# EasyEDA Pro project H7MS-before-compact-pcb-20261017.epro, schematic H7MS_CORE_H735_A1_核心板原理图, sheets 5 to 8 of 8

## Sheets
5 C04_BMI088与加热安全控制: Create Date: 2026-10-17; Update Date: 2026-10-17
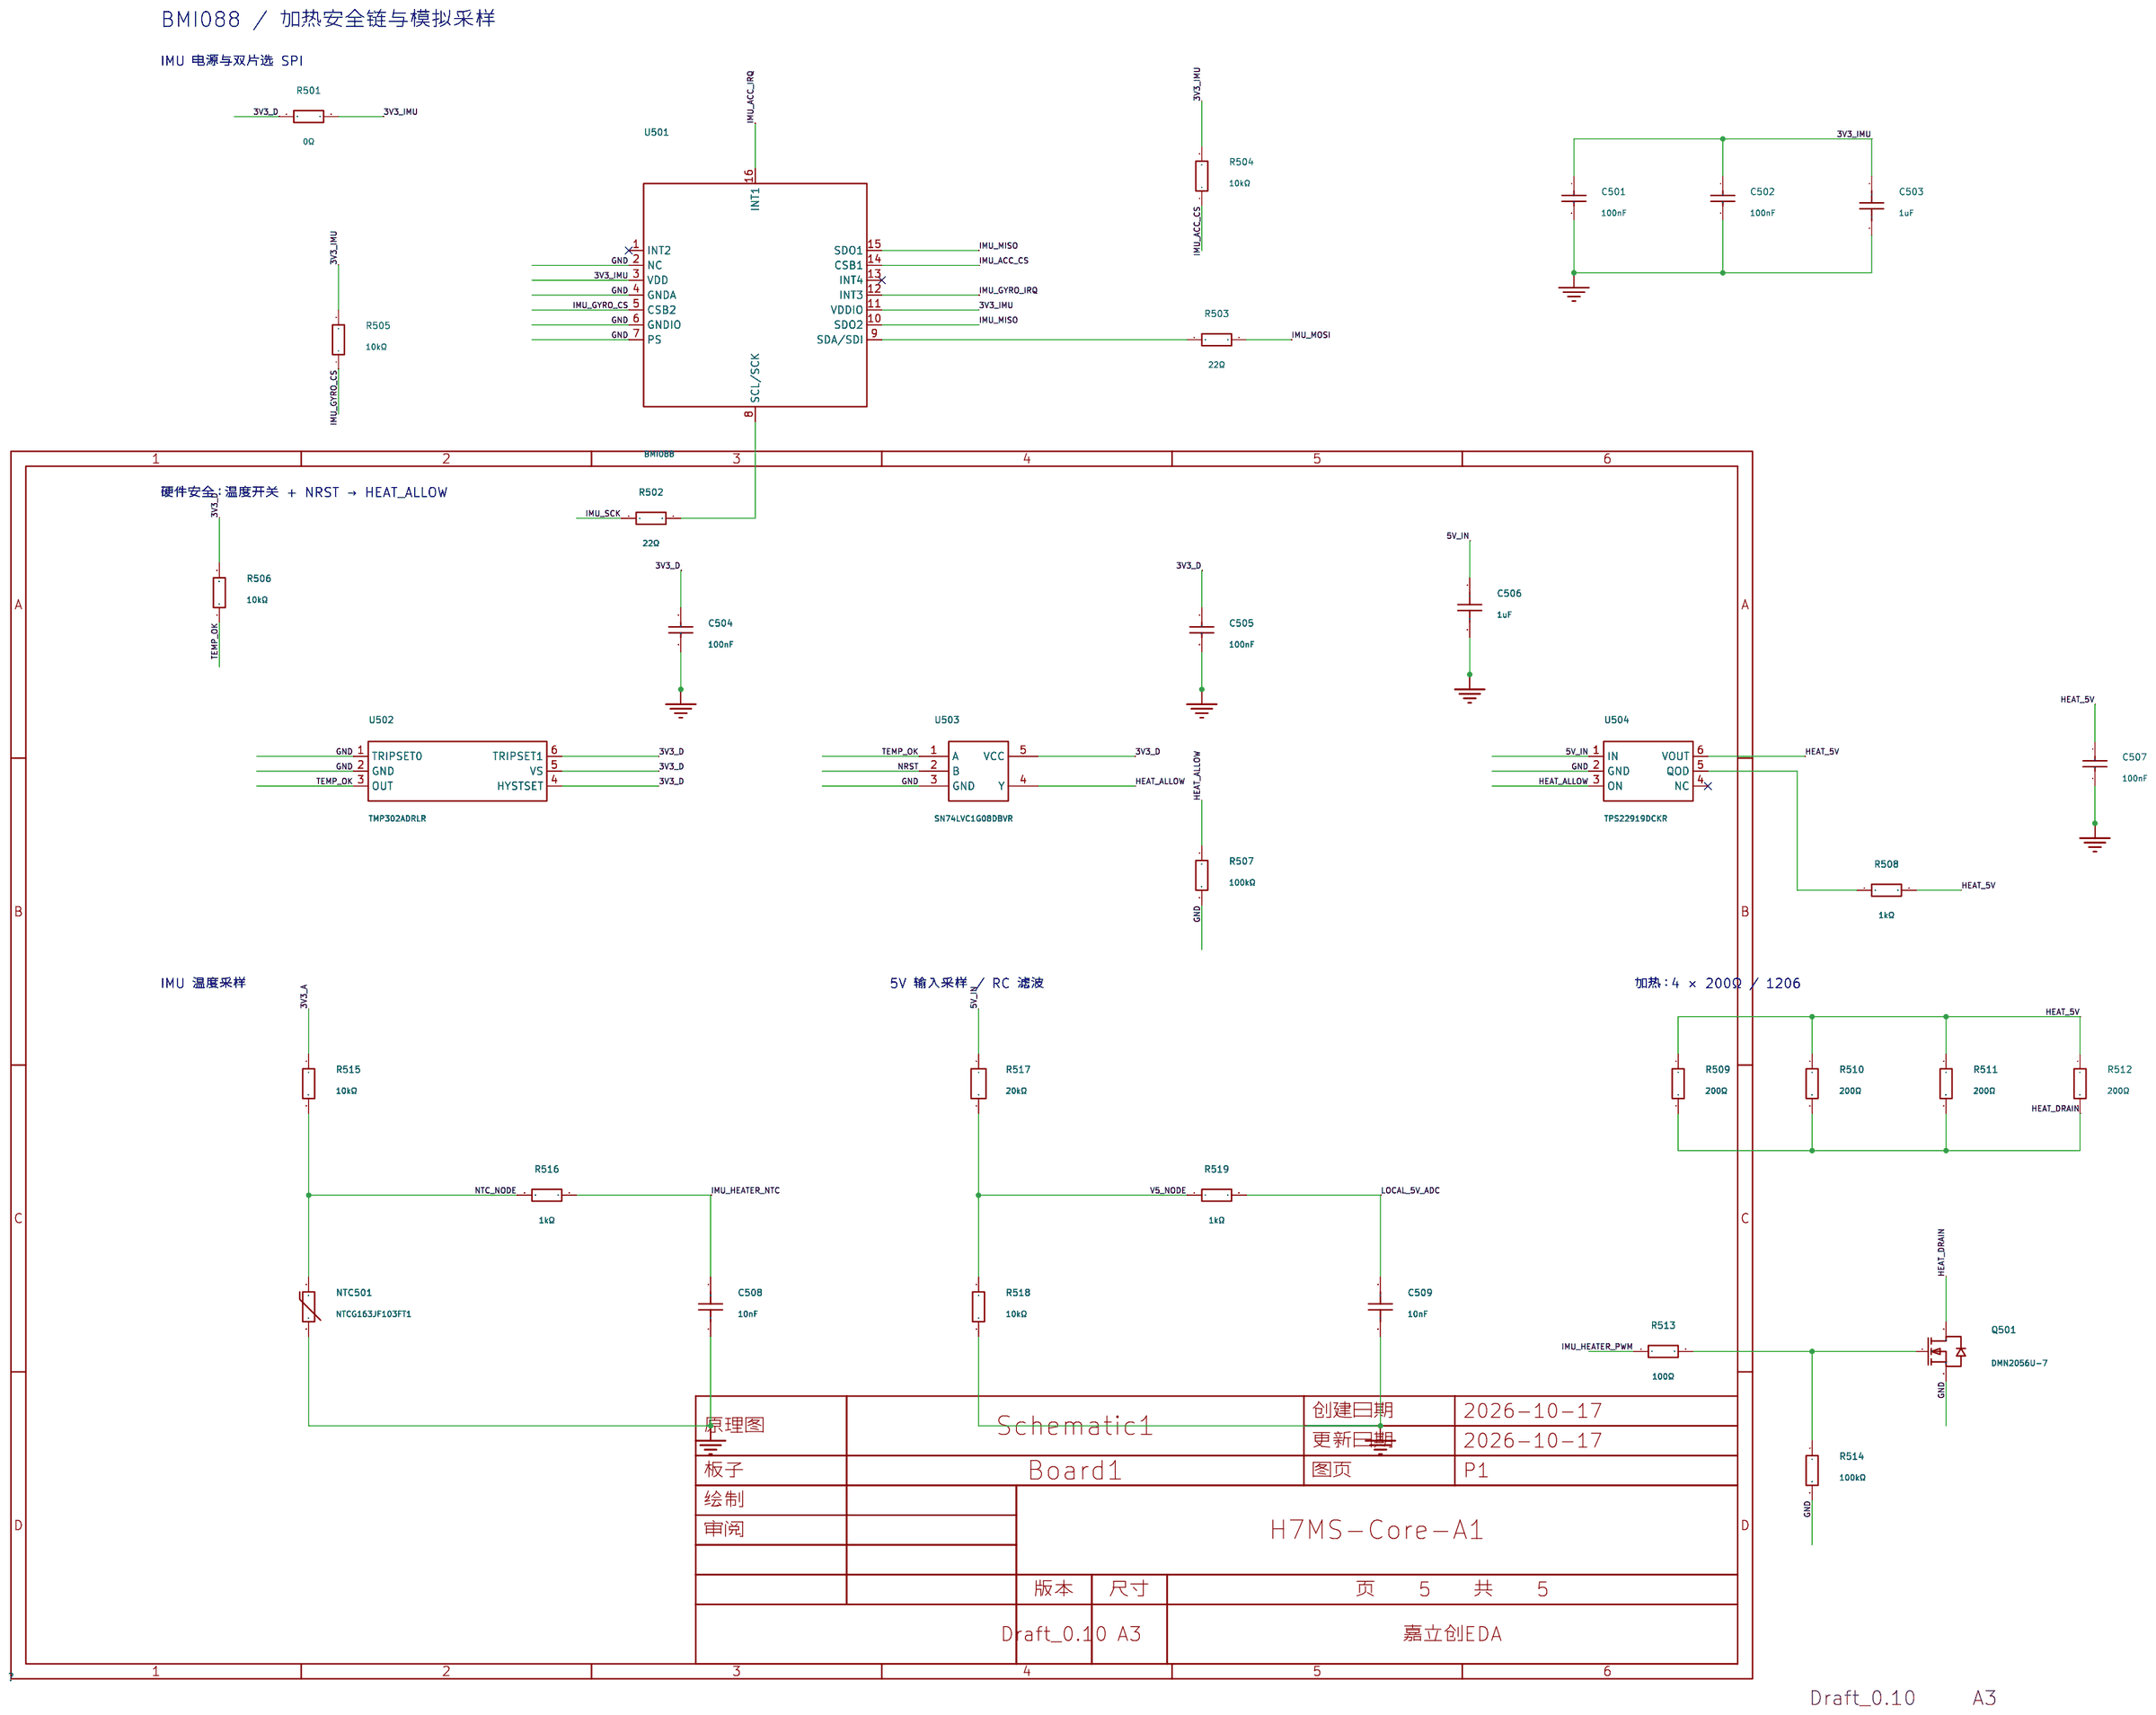
[diagram p4: C04_BMI088与加热安全控制]
6 C05_CAN三路收发与保护: Create Date: 2026-10-17; Update Date: 2026-10-17
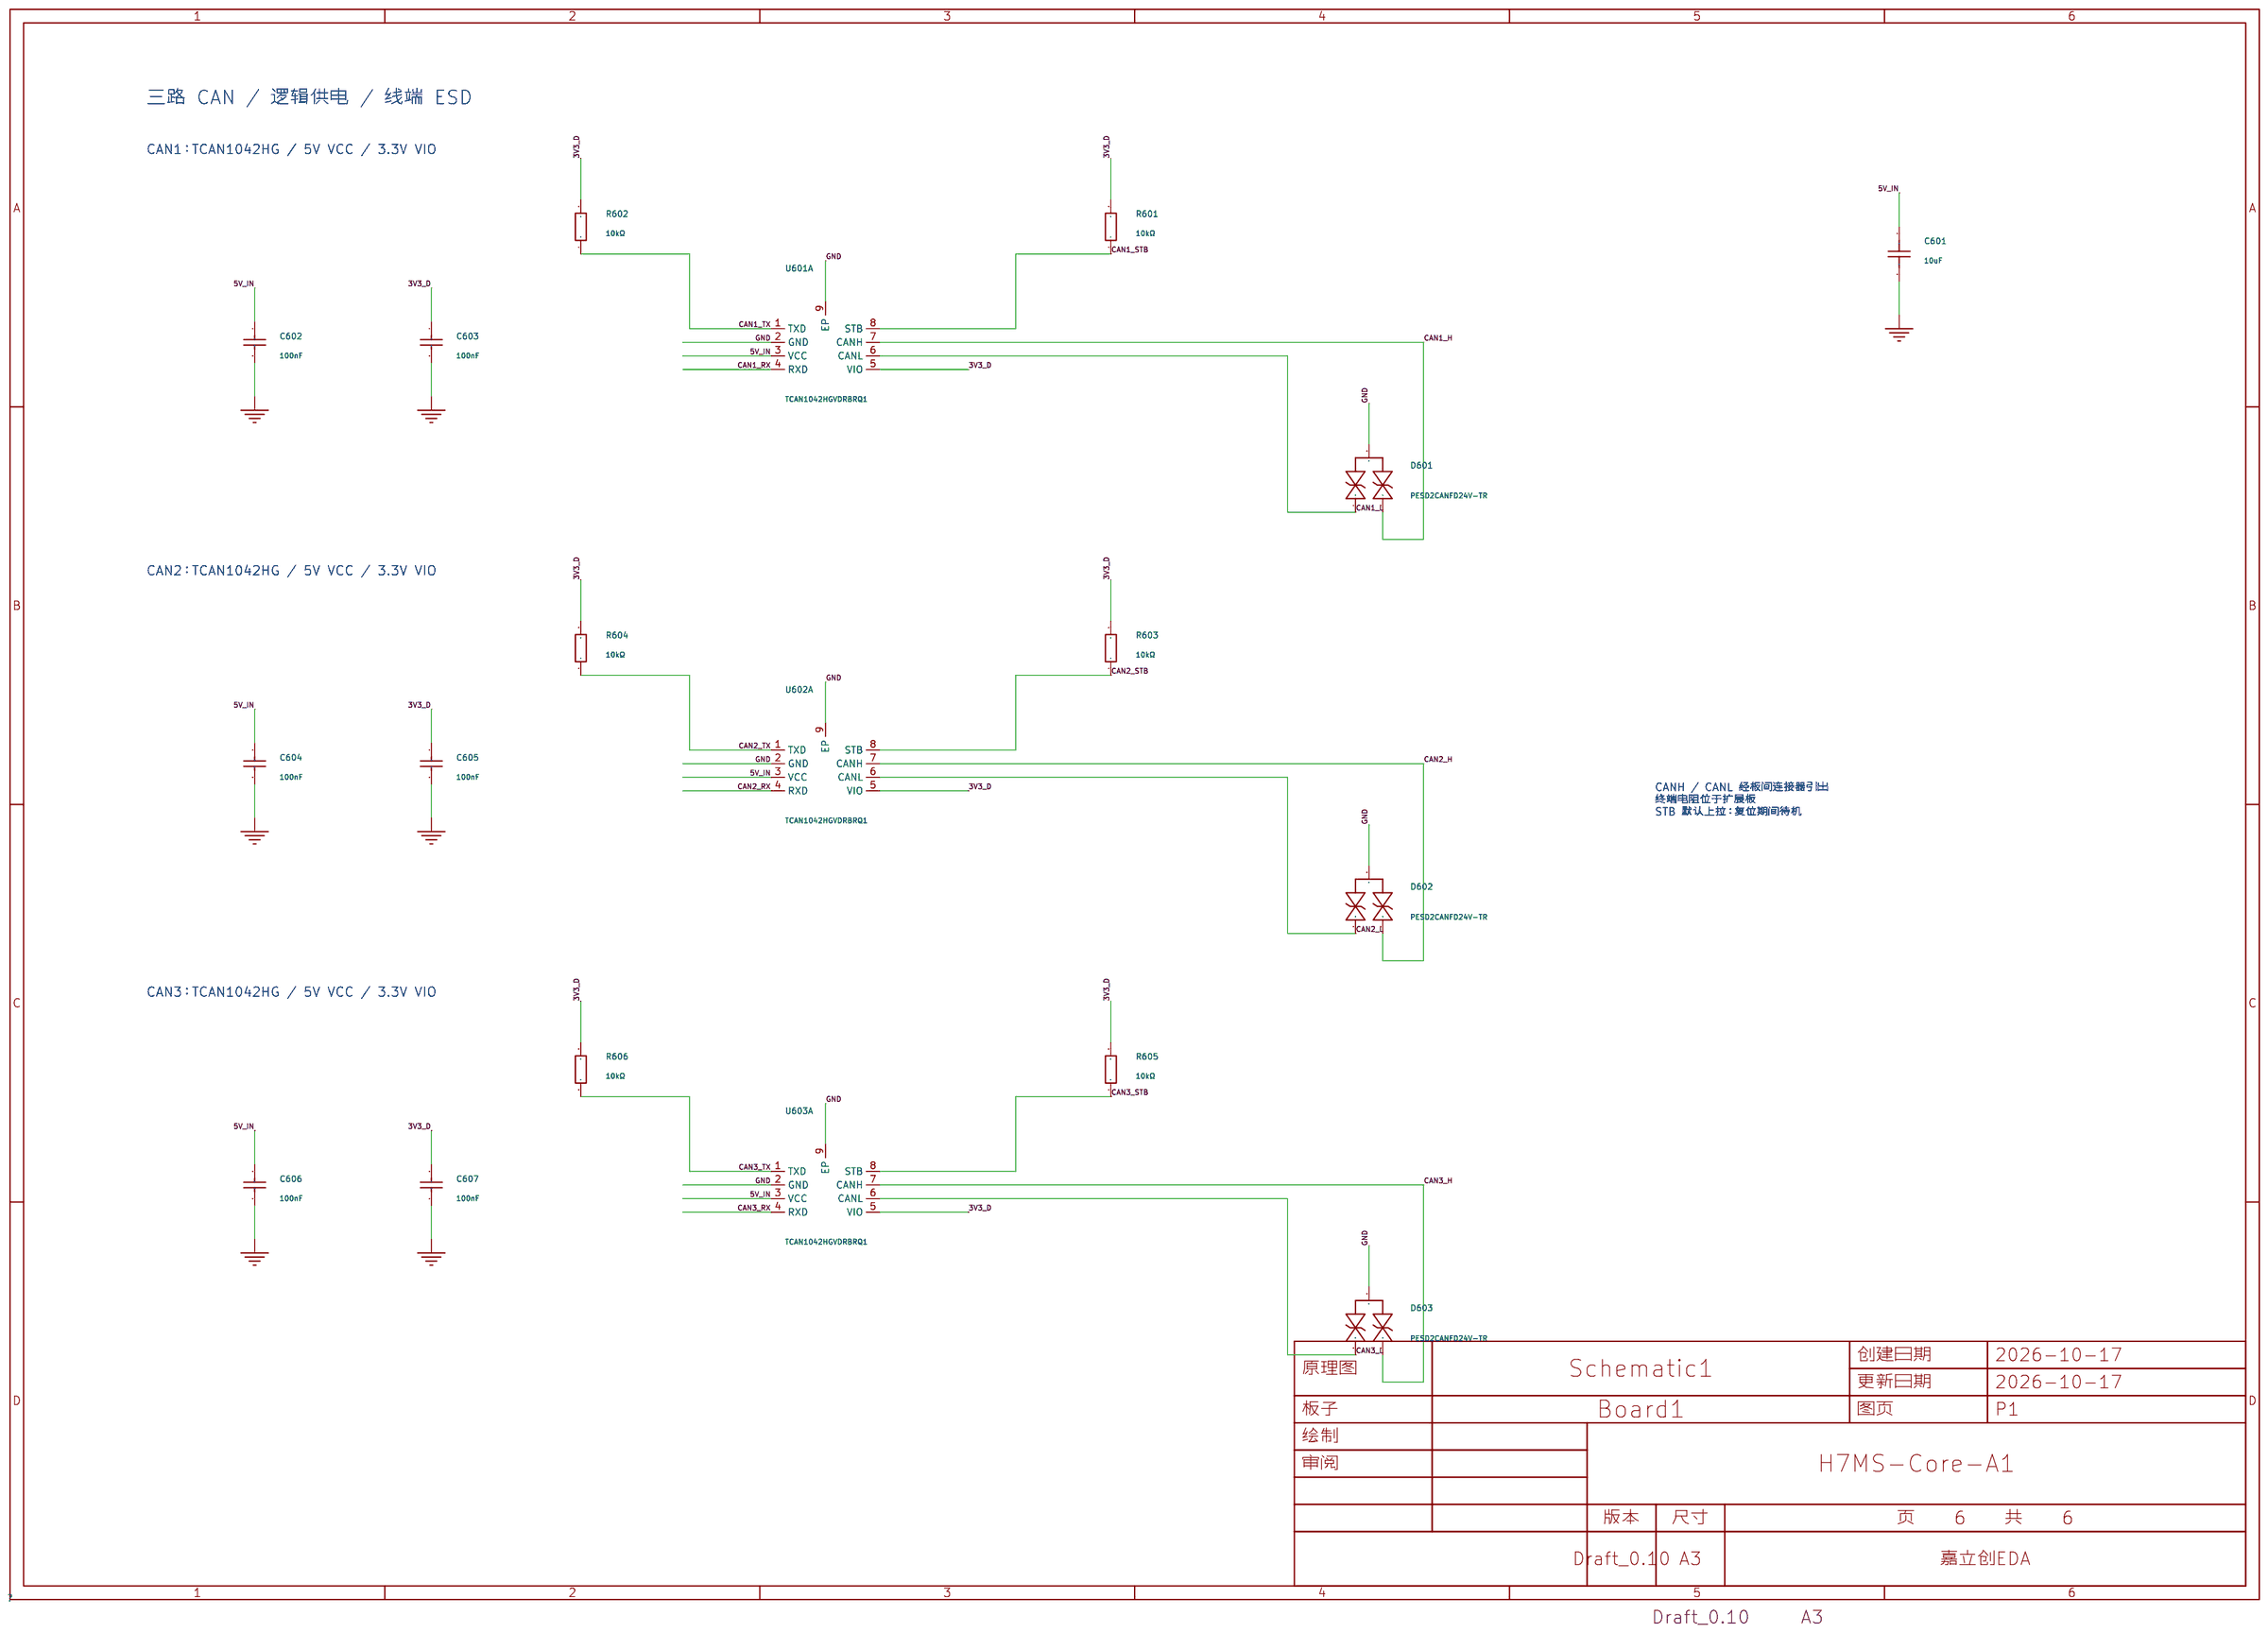
[diagram p5: C05_CAN三路收发与保护]
7 C06_USB设备接口与VBUS检测: Create Date: 2026-10-17; Update Date: 2026-10-17
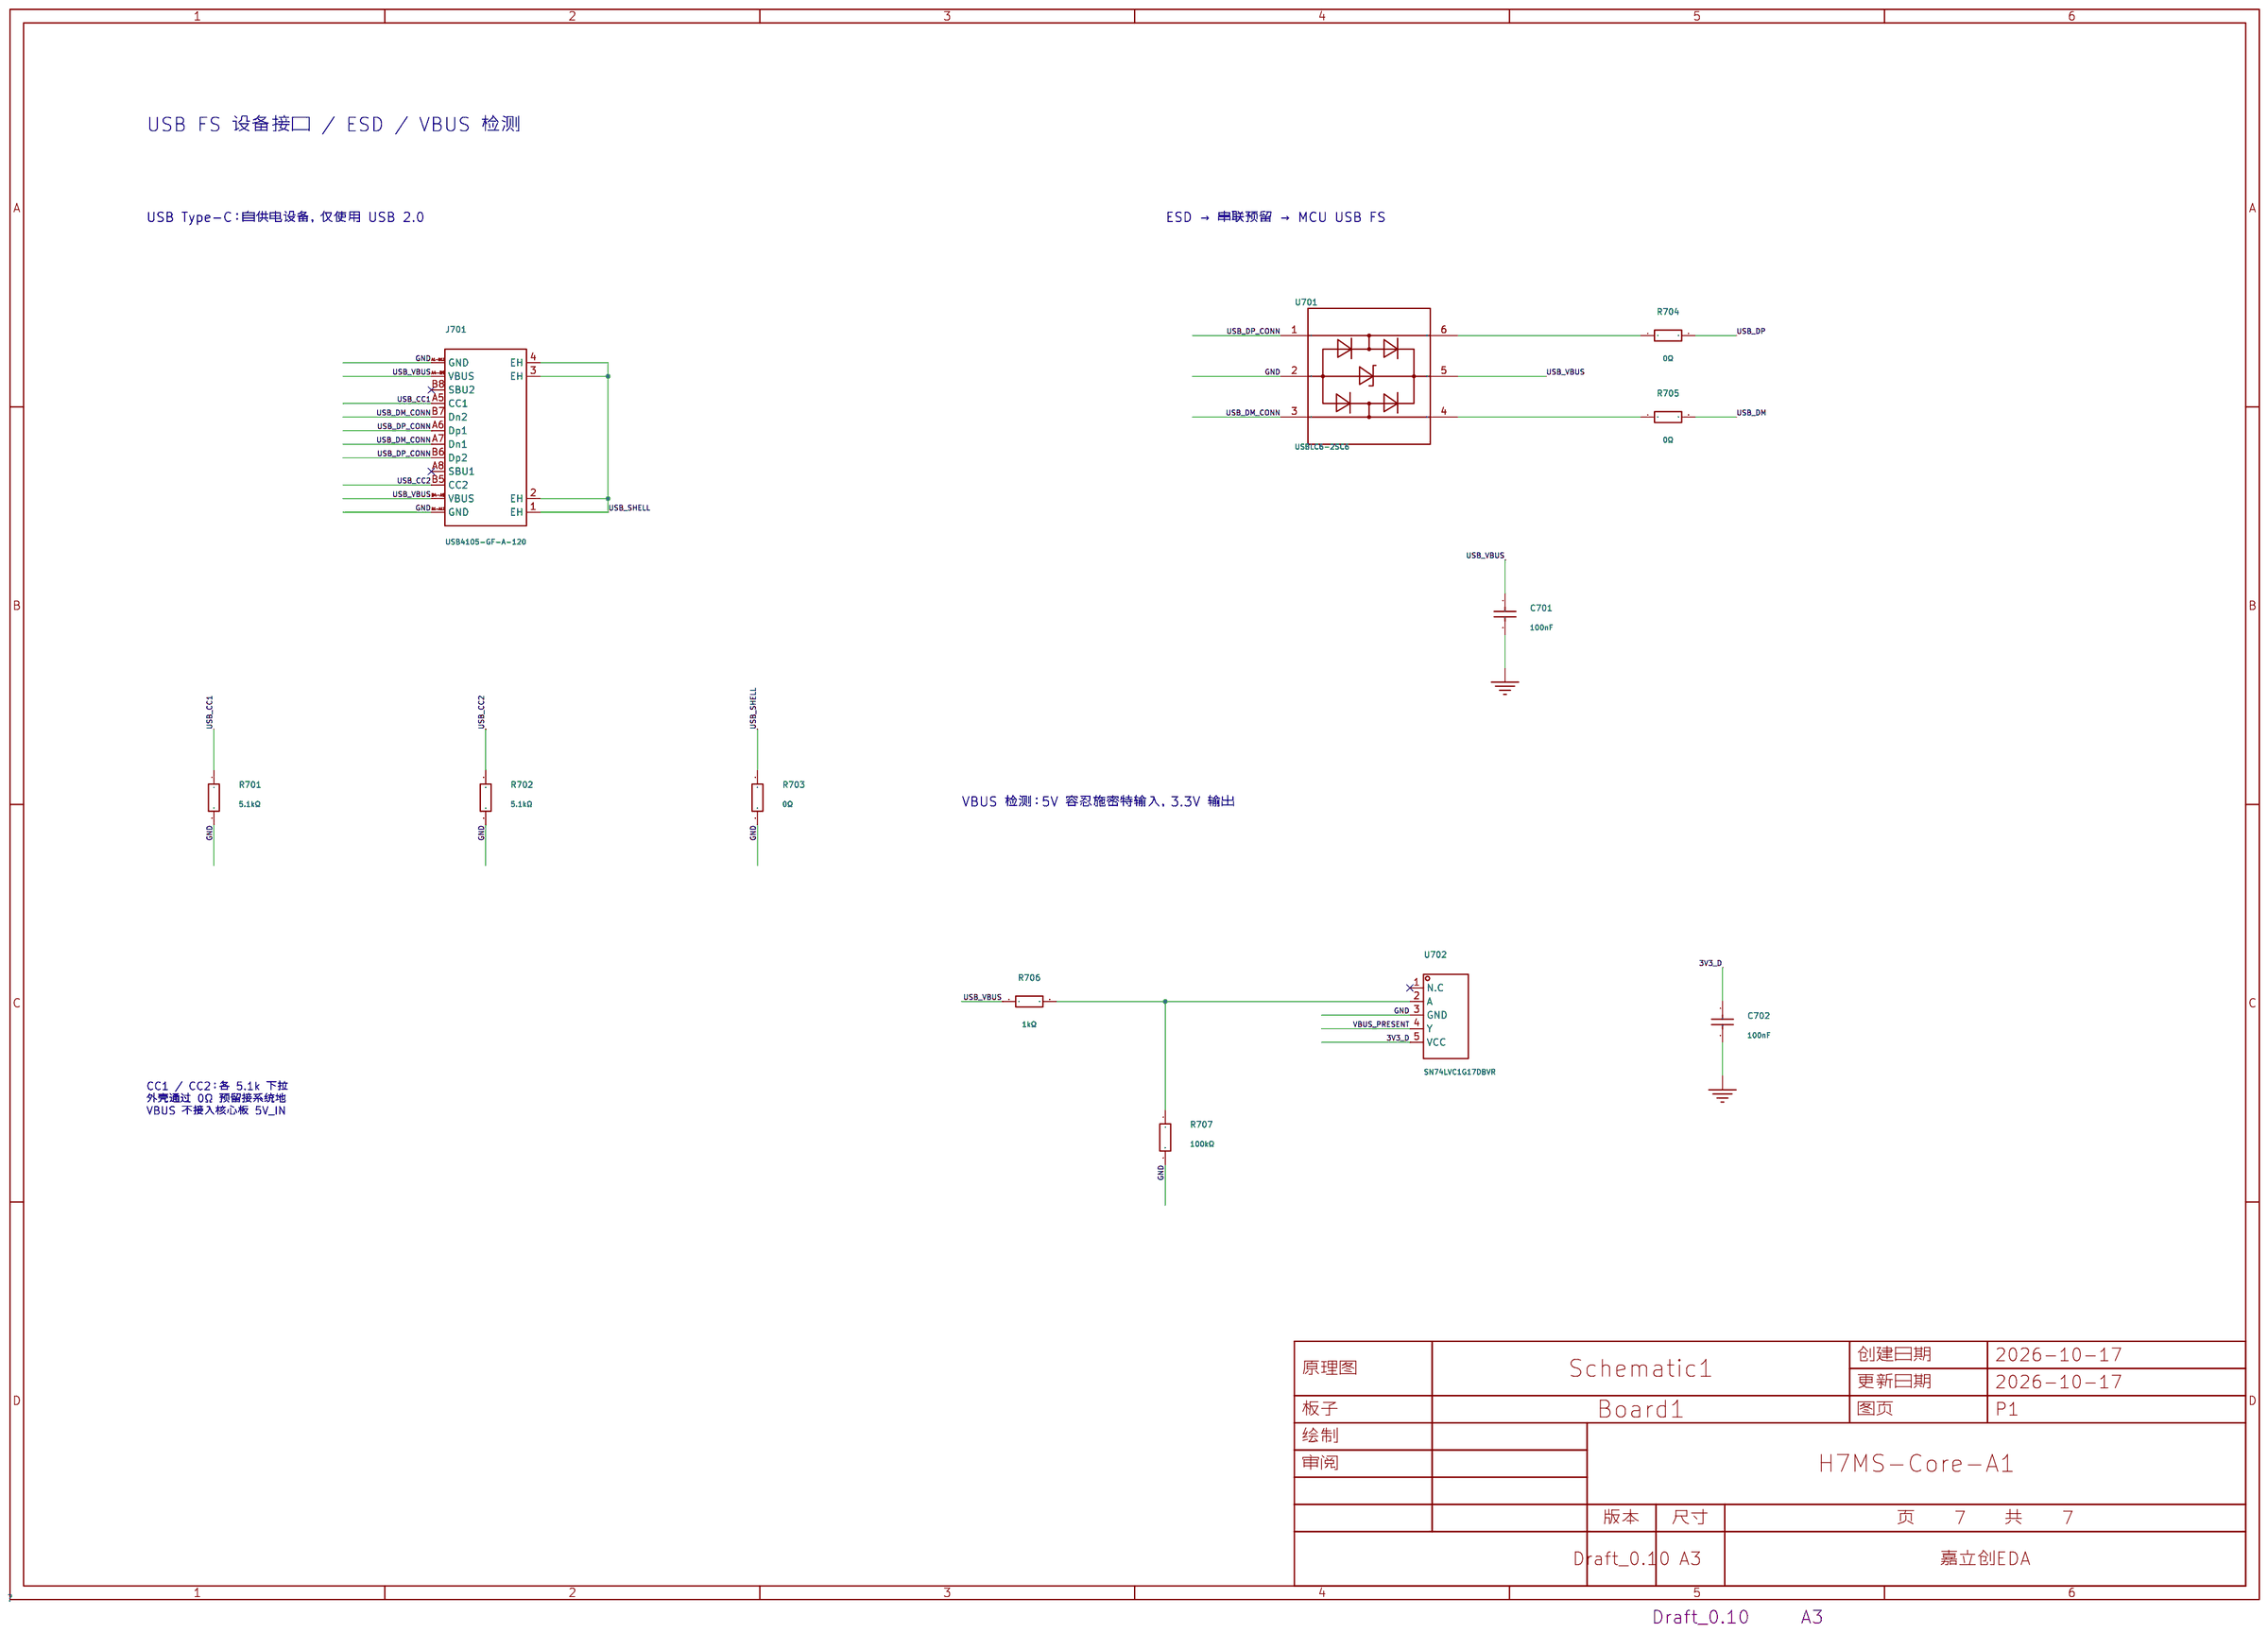
[diagram p6: C06_USB设备接口与VBUS检测]
8 C07_板间连接器与测试点: Create Date: 2026-10-17; Update Date: 2026-10-17
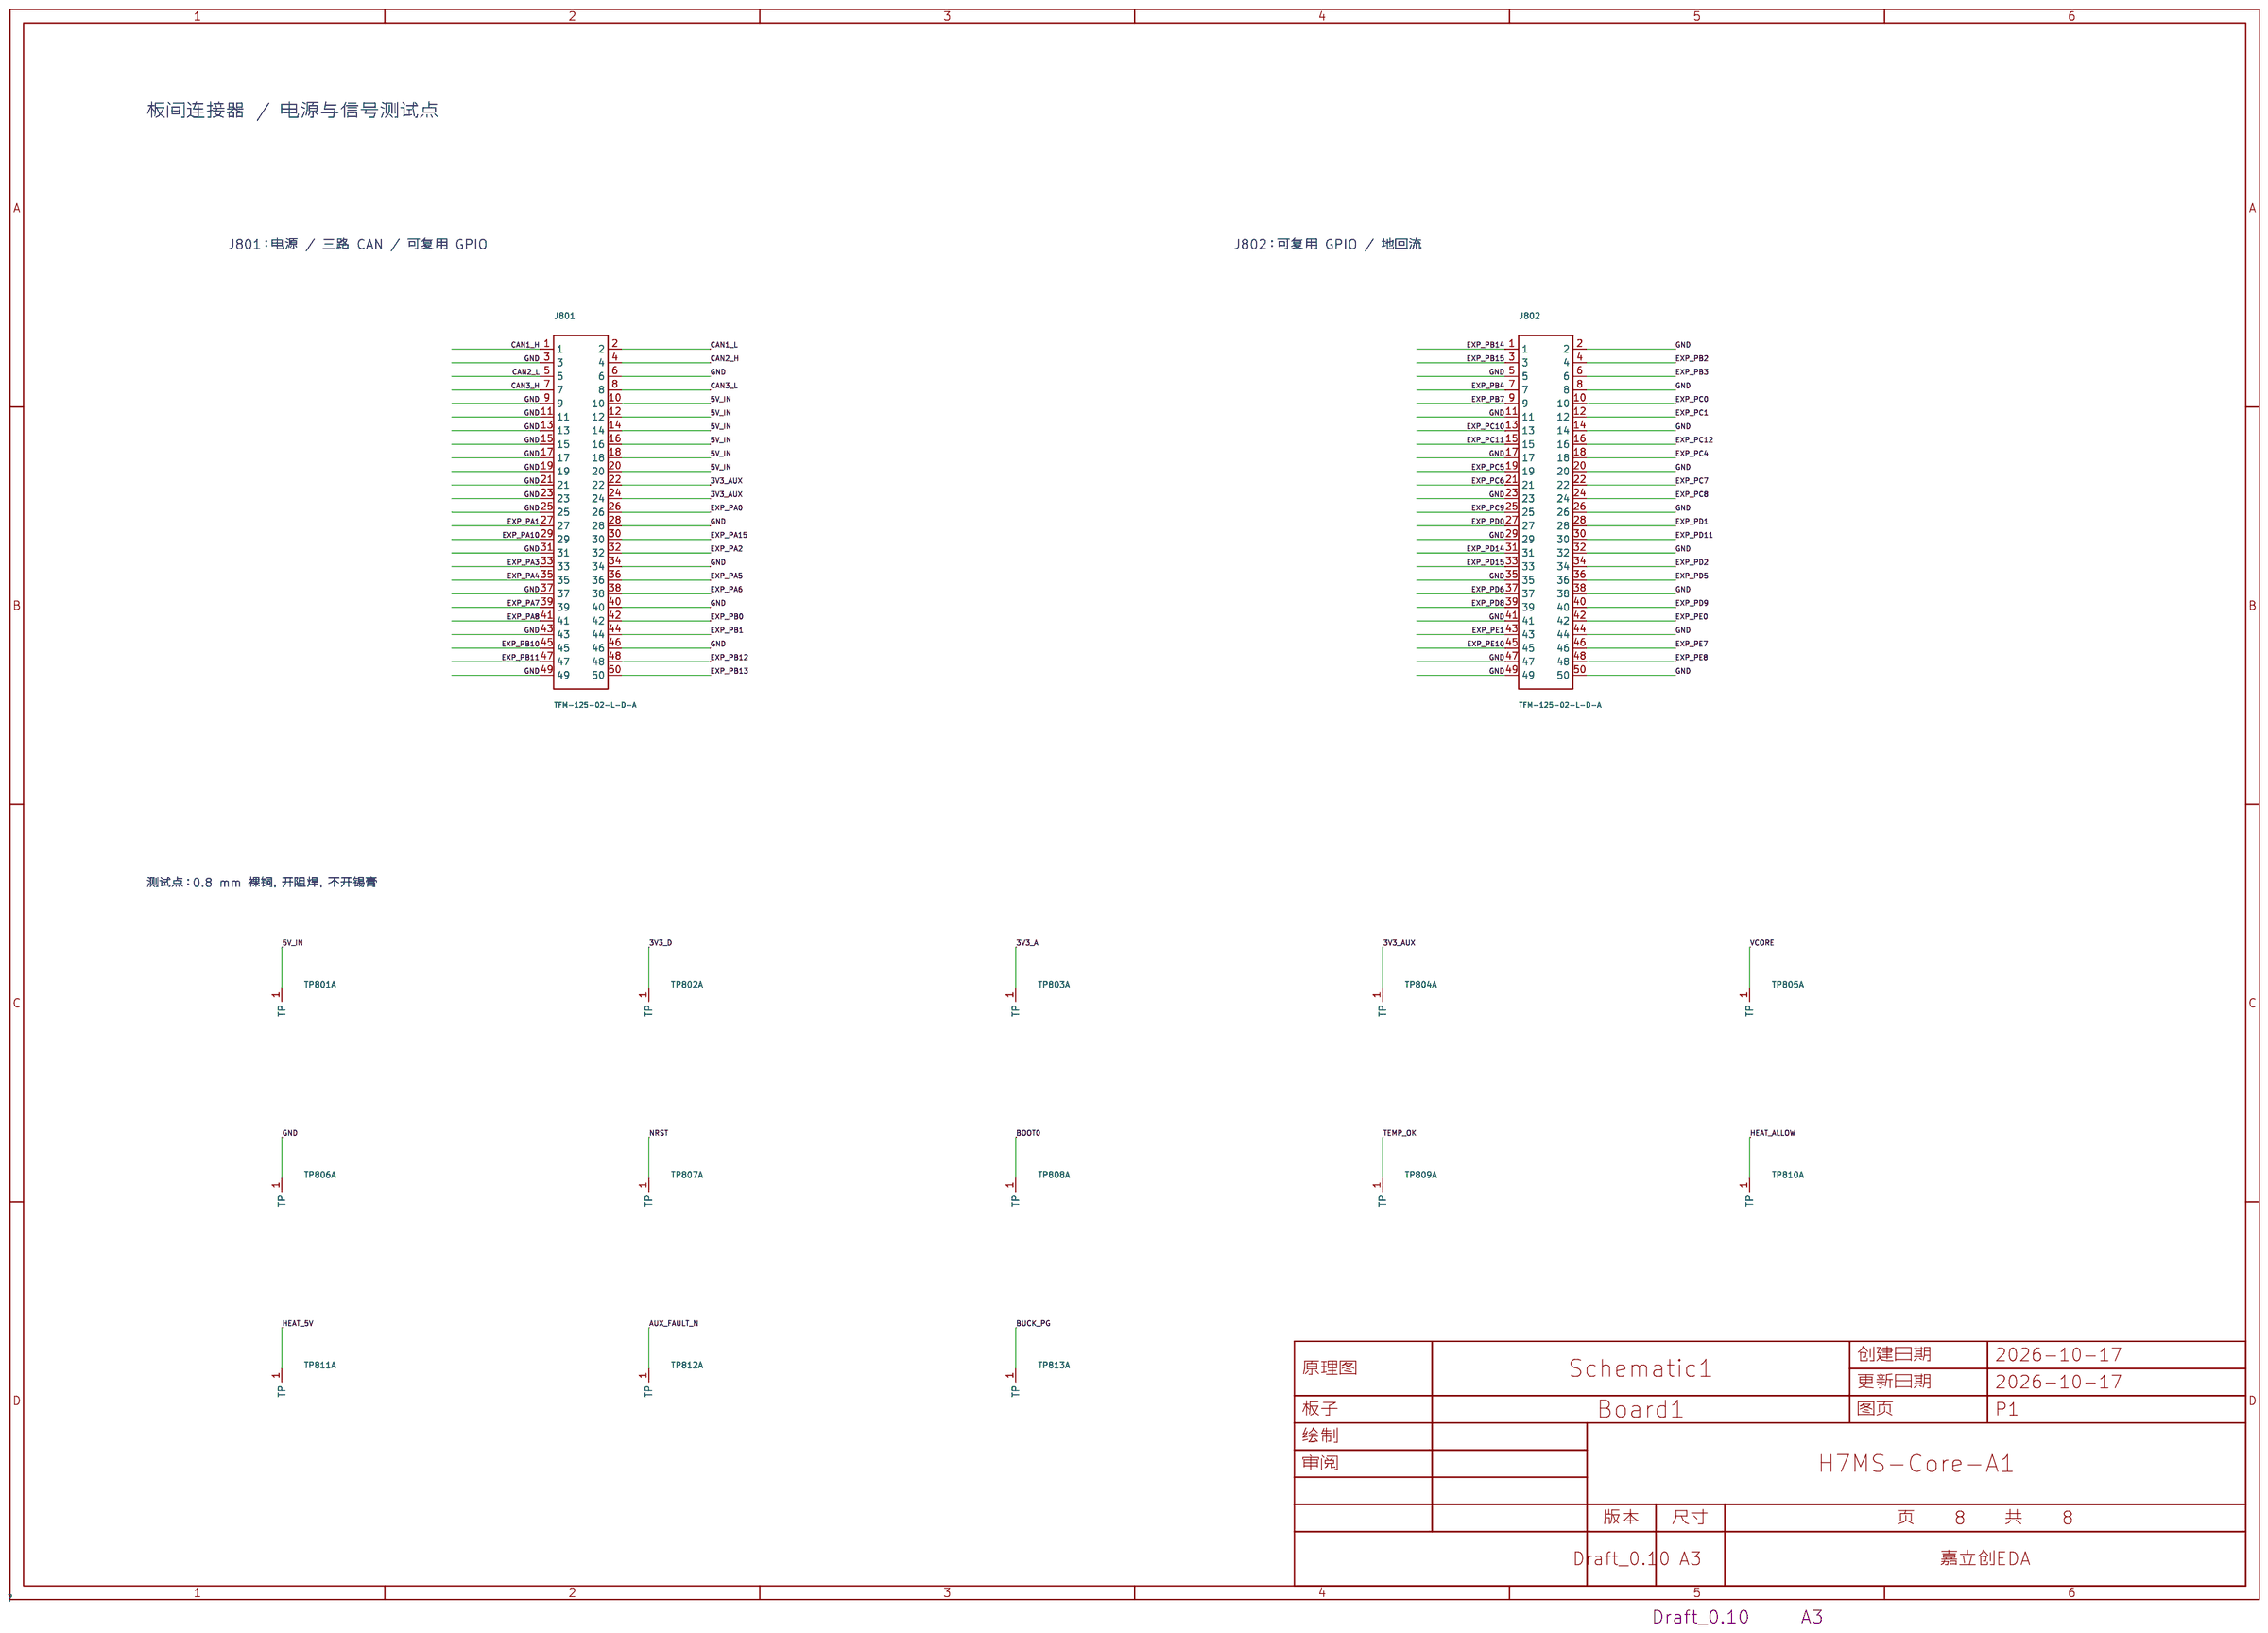
[diagram p7: C07_板间连接器与测试点]

## Parts
sheet C04_BMI088与加热安全控制
C501  100nF  [C0402]
C502  100nF  [C0402]
C503  1uF  [C0603]
C504  100nF  [C0402]
C505  100nF  [C0402]
C506  1uF  [C0603]
C507  100nF  [C0402]
C508  10nF  [C0402]
C509  10nF  [C0402]
NTC501  NTCG163JF103FT1  [R0603]
Q501  DMN2056U-7  [SOT-23-3_L2.9-W1.6-P1.90-LS2.8-BR]
R501  0Ω  [R0805]
R502  22Ω  [R0402]
R503  22Ω  [R0402]
R504  10kΩ  [R0402]
R505  10kΩ  [R0402]
R506  10kΩ  [R0402]
R507  100kΩ  [R0402]
R508  1kΩ  [R0402]
R509  200Ω  [R1206]
R510  200Ω  [R1206]
R511  200Ω  [R1206]
R512  200Ω  [R1206]
R513  100Ω  [R0402]
R514  100kΩ  [R0402]
R515  10kΩ  [R0402]
R516  1kΩ  [R0402]
R517  20kΩ  [R0402]
R518  10kΩ  [R0402]
R519  1kΩ  [R0402]
U501  BMI088  [LGA-16_L4.5-W3.0-P0.50-BL]
U502  TMP302ADRLR  [SOT-5X3-6_W1.6-L1.2-P0.50-LS1.6-BL]
U503  SN74LVC1G08DBVR  [SOT-23-5_L3.0-W1.7-P0.95-LS2.8-BR]
U504  TPS22919DCKR  [SC-70-6_L2.2-W1.3-P0.65-LS2.1-BR]
sheet C05_CAN三路收发与保护
C601  10uF  [C0805]
C602  100nF  [C0402]
C603  100nF  [C0402]
C604  100nF  [C0402]
C605  100nF  [C0402]
C606  100nF  [C0402]
C607  100nF  [C0402]
D601  PESD2CANFD24V-TR  [SOT-23-3_L2.9-W1.3-P1.90-LS2.4-BR]
D602  PESD2CANFD24V-TR  [SOT-23-3_L2.9-W1.3-P1.90-LS2.4-BR]
D603  PESD2CANFD24V-TR  [SOT-23-3_L2.9-W1.3-P1.90-LS2.4-BR]
R601  10kΩ  [R0402]
R602  10kΩ  [R0402]
R603  10kΩ  [R0402]
R604  10kΩ  [R0402]
R605  10kΩ  [R0402]
R606  10kΩ  [R0402]
U601  TCAN1042HGVDRBRQ1  [HVSON-8_L3.0-W3.0-P0.65-BL-EP]  (section 1)
U602  TCAN1042HGVDRBRQ1  [HVSON-8_L3.0-W3.0-P0.65-BL-EP]  (section 1)
U603  TCAN1042HGVDRBRQ1  [HVSON-8_L3.0-W3.0-P0.65-BL-EP]  (section 1)
sheet C06_USB设备接口与VBUS检测
C701  100nF  [C0402]
C702  100nF  [C0402]
J701  USB4105-GF-A-120  [H7MS_USB4105_GF_A_120_B4_R3]
R701  5.1kΩ  [R0402]
R702  5.1kΩ  [R0402]
R703  0Ω  [R0402]
R704  0Ω  [R0402]
R705  0Ω  [R0402]
R706  1kΩ  [R0402]
R707  100kΩ  [R0402]
U701  USBLC6-2SC6  [SOT-23-6_L2.9-W1.6-P0.95-LS2.8-BL]
U702  SN74LVC1G17DBVR  [SOT-23-5_L3.0-W1.7-P0.95-LS2.8-BR]
sheet C07_板间连接器与测试点
J801  TFM-125-02-L-D-A  [CONN-SMD_50P-P1.27_TFM-125-02-L-D-A]
J802  TFM-125-02-L-D-A  [CONN-SMD_50P-P1.27_TFM-125-02-L-D-A]
TP801  PCB_TP_0.8  [H7MS_TP_0p8_NOMASKPASTE]  (section 1)  (no BOM)
TP802  PCB_TP_0.8  [H7MS_TP_0p8_NOMASKPASTE]  (section 1)  (no BOM)
TP803  PCB_TP_0.8  [H7MS_TP_0p8_NOMASKPASTE]  (section 1)  (no BOM)
TP804  PCB_TP_0.8  [H7MS_TP_0p8_NOMASKPASTE]  (section 1)  (no BOM)
TP805  PCB_TP_0.8  [H7MS_TP_0p8_NOMASKPASTE]  (section 1)  (no BOM)
TP806  PCB_TP_0.8  [H7MS_TP_0p8_NOMASKPASTE]  (section 1)  (no BOM)
TP807  PCB_TP_0.8  [H7MS_TP_0p8_NOMASKPASTE]  (section 1)  (no BOM)
TP808  PCB_TP_0.8  [H7MS_TP_0p8_NOMASKPASTE]  (section 1)  (no BOM)
TP809  PCB_TP_0.8  [H7MS_TP_0p8_NOMASKPASTE]  (section 1)  (no BOM)
TP810  PCB_TP_0.8  [H7MS_TP_0p8_NOMASKPASTE]  (section 1)  (no BOM)
TP811  PCB_TP_0.8  [H7MS_TP_0p8_NOMASKPASTE]  (section 1)  (no BOM)
TP812  PCB_TP_0.8  [H7MS_TP_0p8_NOMASKPASTE]  (section 1)  (no BOM)
TP813  PCB_TP_0.8  [H7MS_TP_0p8_NOMASKPASTE]  (section 1)  (no BOM)

## Library data of the parts
C501 = C1005X7R1H104K050BB: 容值:100nF;精度:±10%;额定电压:50V;温度系数:X7R;; LCSC Part Name: 100nF ±10% 50V; Supplier Part: C2181015; Manufacturer: TDK; Supplier Footprint: 0402; JLCPCB Part Class: Extended Part; Datasheet: https://item.szlcsc.com/datasheet/C1005X7R1H104K050BB/2273082.html; Supplier: LCSC; Tolerance: ±10%; Voltage Rating: 50V; Temperature Coefficient: X7R; Function: C_IMU_VDD; H7MS_Function: C_IMU_VDD
C502 = C1005X7R1H104K050BB: 容值:100nF;精度:±10%;额定电压:50V;温度系数:X7R;; LCSC Part Name: 100nF ±10% 50V; Supplier Part: C2181015; Manufacturer: TDK; Supplier Footprint: 0402; JLCPCB Part Class: Extended Part; Datasheet: https://item.szlcsc.com/datasheet/C1005X7R1H104K050BB/2273082.html; Supplier: LCSC; Tolerance: ±10%; Voltage Rating: 50V; Temperature Coefficient: X7R; Function: C_IMU_VDDIO; H7MS_Function: C_IMU_VDDIO
C503 = C1608X7R1C105K080AC: 容值:1uF;精度:±10%;额定电压:16V;温度系数:X7R;; LCSC Part Name: 1uF ±10% 16V; Supplier Part: C2167399; Manufacturer: TDK; Supplier Footprint: 0603; JLCPCB Part Class: Extended Part; Datasheet: https://item.szlcsc.com/datasheet/C1608X7R1C105K080AC/2259451.html; Supplier: LCSC; Tolerance: ±10%; Voltage Rating: 16V; Temperature Coefficient: X7R; Function: C_IMU_BULK; H7MS_Function: C_IMU_BULK
C504 = C1005X7R1H104K050BB: 容值:100nF;精度:±10%;额定电压:50V;温度系数:X7R;; LCSC Part Name: 100nF ±10% 50V; Supplier Part: C2181015; Manufacturer: TDK; Supplier Footprint: 0402; JLCPCB Part Class: Extended Part; Datasheet: https://item.szlcsc.com/datasheet/C1005X7R1H104K050BB/2273082.html; Supplier: LCSC; Tolerance: ±10%; Voltage Rating: 50V; Temperature Coefficient: X7R; Function: C_TEMP; H7MS_Function: C_TEMP
C505 = C1005X7R1H104K050BB: 容值:100nF;精度:±10%;额定电压:50V;温度系数:X7R;; LCSC Part Name: 100nF ±10% 50V; Supplier Part: C2181015; Manufacturer: TDK; Supplier Footprint: 0402; JLCPCB Part Class: Extended Part; Datasheet: https://item.szlcsc.com/datasheet/C1005X7R1H104K050BB/2273082.html; Supplier: LCSC; Tolerance: ±10%; Voltage Rating: 50V; Temperature Coefficient: X7R; Function: C_U_HEAT_GATE; H7MS_Function: C_U_HEAT_GATE
C506 = C1608X7R1C105K080AC: 容值:1uF;精度:±10%;额定电压:16V;温度系数:X7R;; LCSC Part Name: 1uF ±10% 16V; Supplier Part: C2167399; Manufacturer: TDK; Supplier Footprint: 0603; JLCPCB Part Class: Extended Part; Datasheet: https://item.szlcsc.com/datasheet/C1608X7R1C105K080AC/2259451.html; Supplier: LCSC; Tolerance: ±10%; Voltage Rating: 16V; Temperature Coefficient: X7R; Function: C_U_HEAT_POWER_IN; H7MS_Function: C_U_HEAT_POWER_IN
C507 = C1005X7R1H104K050BB: 容值:100nF;精度:±10%;额定电压:50V;温度系数:X7R;; LCSC Part Name: 100nF ±10% 50V; Supplier Part: C2181015; Manufacturer: TDK; Supplier Footprint: 0402; JLCPCB Part Class: Extended Part; Datasheet: https://item.szlcsc.com/datasheet/C1005X7R1H104K050BB/2273082.html; Supplier: LCSC; Tolerance: ±10%; Voltage Rating: 50V; Temperature Coefficient: X7R; Function: C_U_HEAT_POWER_OUT; H7MS_Function: C_U_HEAT_POWER_OUT
C508 = GRM1555C1H103JE01D: 容值:10nF;精度:±5%;额定电压:50V;温度系数:C0G;; LCSC Part Name: 10nF ±5% 50V; Supplier Part: C22400107; Manufacturer: muRata(村田); Supplier Footprint: 0402; JLCPCB Part Class: Extended Part; Datasheet: https://atta.szlcsc.com/upload/public/pdf/source/20240516/4A564BD6D055E5006B75B6B7BBF3AC7F.pdf; Supplier: LCSC; Tolerance: ±5%; Voltage Rating: 50V; Temperature Coefficient: C0G; Function: C_NTC; H7MS_Function: C_NTC
C509 = GRM1555C1H103JE01D: 容值:10nF;精度:±5%;额定电压:50V;温度系数:C0G;; LCSC Part Name: 10nF ±5% 50V; Supplier Part: C22400107; Manufacturer: muRata(村田); Supplier Footprint: 0402; JLCPCB Part Class: Extended Part; Datasheet: https://atta.szlcsc.com/upload/public/pdf/source/20240516/4A564BD6D055E5006B75B6B7BBF3AC7F.pdf; Supplier: LCSC; Tolerance: ±5%; Voltage Rating: 50V; Temperature Coefficient: C0G; Function: C_V5; H7MS_Function: C_V5
NTC501 = NTCG163JF103FT1: 功率:100mW;阻值:10kΩ;电阻精度:±1%;B值精度:±1%;B值(25℃/50℃):3380K;最大稳态电流(25℃):310uA;; LCSC Part Name: 10kΩ 3380K 100mW; Supplier Part: C76589; Manufacturer: TDK; Supplier Footprint: 0603; JLCPCB Part Class: Extended Part; Datasheet: https://item.szlcsc.com/datasheet/NTCG163JF103FT1/77716.html; Supplier: LCSC; Power(Watts): 100mW; Resistance @ 25℃: 10kΩ; Resistance Tolerance: ±1%; B Constant Tolerance: ±1%; B Constant (25℃/50℃): 3380K; B Constant (25℃/75℃): 3422K; B Constant (25℃/85℃): 3435K; B Constant (25℃/100℃): 3453K; Steady State Current (Max): 310uA; Dissipation Factor: 1mW/℃; Operating Temperature: -40℃~+125℃; Length: 1.6mm; Width: 0.8mm; Height: 0.8mm; Function: NTC1; H7MS_Function: NTC1
Q501 = DMN2056U-7: 数量:1个N沟道;漏源电压(Vdss):20V;连续漏极电流(Id):4A;导通电阻(RDS(on)):45mΩ@2.5V;耗散功率(Pd):940mW;阈值电压(Vgs(th)):1V;; LCSC Part Name: 1个N沟道 耐压:20V 电流:4A; Supplier Part: C332302; Manufacturer: DIODES(美台); Supplier Footprint: SOT-23; JLCPCB Part Class: Extended Part; Datasheet: https://item.szlcsc.com/datasheet/DMN2056U-7/311108.html; Supplier: LCSC; Number: 1个N沟道; Drain to Source Voltage: 20V; Current - Continuous Drain(Id): 4A; RDS(on): 45mΩ@2.5V; Pd - Power Dissipation: 940mW; Gate Threshold Voltage (Vgs(th)): 1V; Gate Charge(Qg): 4.3nC@4.5V; Input Capacitance(Ciss): 339pF; Reverse Transfer Capacitance (Crss@Vds): 34pF; Operating Temperature: -55℃~+150℃; Type: N沟道; Output Capacitance(Coss): 47pF; Function: Q_HEAT; H7MS_Function: Q_HEAT
R501 = RC0805JR-070RL: 电阻类型:厚膜电阻;阻值:0Ω;精度:±5%;功率:125mW;工作电压:150V;温度系数:-;; LCSC Part Name: 厚膜电阻 0Ω ±5% 125mW; Supplier Part: C96345; Manufacturer: YAGEO(国巨); Supplier Footprint: 0805; JLCPCB Part Class: Extended Part; Datasheet: https://item.szlcsc.com/datasheet/RC0805JR-070RL/97549.html; Supplier: LCSC; Type: 厚膜电阻; Tolerance: ±5%; Power(Watts): 125mW; Voltage-Supply(Max): 150V; Operating Temperature: -55℃~+155℃; Function: R_IMU_POWER; H7MS_Function: R_IMU_POWER
R502 = RC0402FR-0722RL: 电阻类型:厚膜电阻;阻值:22Ω;精度:±1%;功率:62.5mW;最大工作电压:50V;温度系数:±100ppm/℃;; LCSC Part Name: 厚膜电阻 22Ω ±1% 62.5mW; Supplier Part: C114765; Manufacturer: YAGEO(国巨); Supplier Footprint: 0402; JLCPCB Part Class: Extended Part; Datasheet: https://atta.szlcsc.com/upload/public/pdf/source/20180821/C275644_0D56F95EFF785E7D9A1FEF436B37DA78.pdf; Supplier: LCSC; Type: 厚膜电阻; Tolerance: ±1%; Power(Watts): 62.5mW; Overload Voltage (Max): 50V; Temperature Coefficient: ±100ppm/℃; Operating Temperature Range: -55℃~+155℃; Function: R_IMU_SCK; H7MS_Function: R_IMU_SCK
R503 = RC0402FR-0722RL: 电阻类型:厚膜电阻;阻值:22Ω;精度:±1%;功率:62.5mW;最大工作电压:50V;温度系数:±100ppm/℃;; LCSC Part Name: 厚膜电阻 22Ω ±1% 62.5mW; Supplier Part: C114765; Manufacturer: YAGEO(国巨); Supplier Footprint: 0402; JLCPCB Part Class: Extended Part; Datasheet: https://atta.szlcsc.com/upload/public/pdf/source/20180821/C275644_0D56F95EFF785E7D9A1FEF436B37DA78.pdf; Supplier: LCSC; Type: 厚膜电阻; Tolerance: ±1%; Power(Watts): 62.5mW; Overload Voltage (Max): 50V; Temperature Coefficient: ±100ppm/℃; Operating Temperature Range: -55℃~+155℃; Function: R_IMU_MOSI; H7MS_Function: R_IMU_MOSI
R504 = RC0402FR-0710KL: 电阻类型:厚膜电阻;阻值:10kΩ;精度:±1%;功率:62.5mW;工作电压:50V;温度系数:±100ppm/℃;; LCSC Part Name: 厚膜电阻 10kΩ ±1% 62.5mW; Supplier Part: C60490; Manufacturer: YAGEO(国巨); Supplier Footprint: 0402; JLCPCB Part Class: Extended Part; Datasheet: https://item.szlcsc.com/datasheet/RC0402FR-0710KL/61542.html; Supplier: LCSC; Type: 厚膜电阻; Tolerance: ±1%; Power(Watts): 62.5mW; Voltage-Supply(Max): 50V; Temperature Coefficient: ±100ppm/℃; Operating Temperature: -55℃~+155℃; Function: R_IMU_ACC_CS; H7MS_Function: R_IMU_ACC_CS
R505 = RC0402FR-0710KL: 电阻类型:厚膜电阻;阻值:10kΩ;精度:±1%;功率:62.5mW;工作电压:50V;温度系数:±100ppm/℃;; LCSC Part Name: 厚膜电阻 10kΩ ±1% 62.5mW; Supplier Part: C60490; Manufacturer: YAGEO(国巨); Supplier Footprint: 0402; JLCPCB Part Class: Extended Part; Datasheet: https://item.szlcsc.com/datasheet/RC0402FR-0710KL/61542.html; Supplier: LCSC; Type: 厚膜电阻; Tolerance: ±1%; Power(Watts): 62.5mW; Voltage-Supply(Max): 50V; Temperature Coefficient: ±100ppm/℃; Operating Temperature: -55℃~+155℃; Function: R_IMU_GYRO_CS; H7MS_Function: R_IMU_GYRO_CS
R506 = RC0402FR-0710KL: 电阻类型:厚膜电阻;阻值:10kΩ;精度:±1%;功率:62.5mW;工作电压:50V;温度系数:±100ppm/℃;; LCSC Part Name: 厚膜电阻 10kΩ ±1% 62.5mW; Supplier Part: C60490; Manufacturer: YAGEO(国巨); Supplier Footprint: 0402; JLCPCB Part Class: Extended Part; Datasheet: https://item.szlcsc.com/datasheet/RC0402FR-0710KL/61542.html; Supplier: LCSC; Type: 厚膜电阻; Tolerance: ±1%; Power(Watts): 62.5mW; Voltage-Supply(Max): 50V; Temperature Coefficient: ±100ppm/℃; Operating Temperature: -55℃~+155℃; Function: R_TEMP; H7MS_Function: R_TEMP
R507 = RC0402FR-07100KL: 电阻类型:厚膜电阻;阻值:100kΩ;精度:±1%;功率:62.5mW;工作电压:50V;温度系数:±100ppm/℃;; LCSC Part Name: 厚膜电阻 100kΩ ±1% 62.5mW; Supplier Part: C60491; Manufacturer: YAGEO(国巨); Supplier Footprint: 0402; JLCPCB Part Class: Extended Part; Datasheet: https://item.szlcsc.com/datasheet/RC0402FR-07100KL/61543.html; Supplier: LCSC; Type: 厚膜电阻; Tolerance: ±1%; Power(Watts): 62.5mW; Voltage-Supply(Max): 50V; Temperature Coefficient: ±100ppm/℃; Operating Temperature: -55℃~+155℃; Function: R_HEAT_ALLOW; H7MS_Function: R_HEAT_ALLOW
R508 = RC0402FR-071KL: 电阻类型:厚膜电阻;阻值:1kΩ;精度:±1%;功率:62.5mW;工作电压:50V;温度系数:±100ppm/℃;; LCSC Part Name: 厚膜电阻 1kΩ ±1% 62.5mW; Supplier Part: C106235; Manufacturer: YAGEO(国巨); Supplier Footprint: 0402; JLCPCB Part Class: Extended Part; Datasheet: https://item.szlcsc.com/datasheet/RC0402FR-071KL/107450.html; Supplier: LCSC; Type: 厚膜电阻; Tolerance: ±1%; Power(Watts): 62.5mW; Voltage-Supply(Max): 50V; Temperature Coefficient: ±100ppm/℃; Operating Temperature: -55℃~+155℃; Function: R_U_HEAT_POWER_QOD; H7MS_Function: R_U_HEAT_POWER_QOD
R509 = RC1206FR-07200RL: 电阻类型:厚膜电阻;阻值:200Ω;精度:±1%;功率:250mW;工作电压:200V;温度系数:±100ppm/℃;; LCSC Part Name: 厚膜电阻 200Ω ±1% 250mW; Supplier Part: C114939; Manufacturer: YAGEO(国巨); Supplier Footprint: 1206; JLCPCB Part Class: Extended Part; Datasheet: https://item.szlcsc.com/datasheet/RC1206FR-07200RL/116183.html; Supplier: LCSC; Type: 厚膜电阻; Tolerance: ±1%; Power(Watts): 250mW; Voltage-Supply(Max): 200V; Temperature Coefficient: ±100ppm/℃; Operating Temperature: -55℃~+155℃; Function: R_HEAT1; H7MS_Function: R_HEAT1
R510 = RC1206FR-07200RL: 电阻类型:厚膜电阻;阻值:200Ω;精度:±1%;功率:250mW;工作电压:200V;温度系数:±100ppm/℃;; LCSC Part Name: 厚膜电阻 200Ω ±1% 250mW; Supplier Part: C114939; Manufacturer: YAGEO(国巨); Supplier Footprint: 1206; JLCPCB Part Class: Extended Part; Datasheet: https://item.szlcsc.com/datasheet/RC1206FR-07200RL/116183.html; Supplier: LCSC; Type: 厚膜电阻; Tolerance: ±1%; Power(Watts): 250mW; Voltage-Supply(Max): 200V; Temperature Coefficient: ±100ppm/℃; Operating Temperature: -55℃~+155℃; Function: R_HEAT2; H7MS_Function: R_HEAT2
R511 = RC1206FR-07200RL: 电阻类型:厚膜电阻;阻值:200Ω;精度:±1%;功率:250mW;工作电压:200V;温度系数:±100ppm/℃;; LCSC Part Name: 厚膜电阻 200Ω ±1% 250mW; Supplier Part: C114939; Manufacturer: YAGEO(国巨); Supplier Footprint: 1206; JLCPCB Part Class: Extended Part; Datasheet: https://item.szlcsc.com/datasheet/RC1206FR-07200RL/116183.html; Supplier: LCSC; Type: 厚膜电阻; Tolerance: ±1%; Power(Watts): 250mW; Voltage-Supply(Max): 200V; Temperature Coefficient: ±100ppm/℃; Operating Temperature: -55℃~+155℃; Function: R_HEAT3; H7MS_Function: R_HEAT3
R512 = RC1206FR-07200RL: 电阻类型:厚膜电阻;阻值:200Ω;精度:±1%;功率:250mW;工作电压:200V;温度系数:±100ppm/℃;; LCSC Part Name: 厚膜电阻 200Ω ±1% 250mW; Supplier Part: C114939; Manufacturer: YAGEO(国巨); Supplier Footprint: 1206; JLCPCB Part Class: Extended Part; Datasheet: https://item.szlcsc.com/datasheet/RC1206FR-07200RL/116183.html; Supplier: LCSC; Type: 厚膜电阻; Tolerance: ±1%; Power(Watts): 250mW; Voltage-Supply(Max): 200V; Temperature Coefficient: ±100ppm/℃; Operating Temperature: -55℃~+155℃; Function: R_HEAT4; H7MS_Function: R_HEAT4
R513 = RC0402FR-07100RL: 电阻类型:厚膜电阻;阻值:100Ω;精度:±1%;功率:62.5mW;工作电压:50V;温度系数:±100ppm/℃;; LCSC Part Name: 厚膜电阻 100Ω ±1% 62.5mW; Supplier Part: C106232; Manufacturer: YAGEO(国巨); Supplier Footprint: 0402; JLCPCB Part Class: Extended Part; Datasheet: https://item.szlcsc.com/datasheet/RC0402FR-07100RL/107447.html; Supplier: LCSC; Type: 厚膜电阻; Tolerance: ±1%; Power(Watts): 62.5mW; Voltage-Supply(Max): 50V; Temperature Coefficient: ±100ppm/℃; Operating Temperature: -55℃~+155℃; Function: R_HEAT_G; H7MS_Function: R_HEAT_G
R514 = RC0402FR-07100KL: 电阻类型:厚膜电阻;阻值:100kΩ;精度:±1%;功率:62.5mW;工作电压:50V;温度系数:±100ppm/℃;; LCSC Part Name: 厚膜电阻 100kΩ ±1% 62.5mW; Supplier Part: C60491; Manufacturer: YAGEO(国巨); Supplier Footprint: 0402; JLCPCB Part Class: Extended Part; Datasheet: https://item.szlcsc.com/datasheet/RC0402FR-07100KL/61543.html; Supplier: LCSC; Type: 厚膜电阻; Tolerance: ±1%; Power(Watts): 62.5mW; Voltage-Supply(Max): 50V; Temperature Coefficient: ±100ppm/℃; Operating Temperature: -55℃~+155℃; Function: R_HEAT_G_PD; H7MS_Function: R_HEAT_G_PD
R515 = RT0402BRD0710KL: 电阻类型:薄膜电阻;阻值:10kΩ;精度:±0.1%;功率:62.5mW;工作电压:50V;温度系数:±25ppm/℃;; LCSC Part Name: 薄膜电阻 10kΩ ±0.1% 62.5mW; Supplier Part: C190095; Manufacturer: YAGEO(国巨); Supplier Footprint: 0402; JLCPCB Part Class: Extended Part; Datasheet: https://item.szlcsc.com/datasheet/RT0402BRD0710KL/208478.html; Supplier: LCSC; Type: 薄膜电阻; Tolerance: ±0.1%; Power(Watts): 62.5mW; Voltage-Supply(Max): 50V; Temperature Coefficient: ±25ppm/℃; Operating Temperature: -55℃~+155℃; Function: R_NTC_TOP; H7MS_Function: R_NTC_TOP
R516 = RC0402FR-071KL: 电阻类型:厚膜电阻;阻值:1kΩ;精度:±1%;功率:62.5mW;工作电压:50V;温度系数:±100ppm/℃;; LCSC Part Name: 厚膜电阻 1kΩ ±1% 62.5mW; Supplier Part: C106235; Manufacturer: YAGEO(国巨); Supplier Footprint: 0402; JLCPCB Part Class: Extended Part; Datasheet: https://item.szlcsc.com/datasheet/RC0402FR-071KL/107450.html; Supplier: LCSC; Type: 厚膜电阻; Tolerance: ±1%; Power(Watts): 62.5mW; Voltage-Supply(Max): 50V; Temperature Coefficient: ±100ppm/℃; Operating Temperature: -55℃~+155℃; Function: R_NTC_ADC; H7MS_Function: R_NTC_ADC
R517 = RT0402BRD0720KL: 电阻类型:薄膜电阻;阻值:20kΩ;精度:±0.1%;功率:62.5mW;温度系数:±25ppm/℃;; LCSC Part Name: 薄膜电阻 20kΩ ±0.1% 62.5mW; Supplier Part: C705630; Manufacturer: YAGEO(国巨); Supplier Footprint: 0402; JLCPCB Part Class: Extended Part; Datasheet: https://atta.szlcsc.com/upload/public/pdf/source/20200720/C705630_F5CFB4D98A44D6C8057FA709CC75CD60.pdf; Supplier: LCSC; Type: 薄膜电阻; Tolerance: ±0.1%; Power(Watts): 62.5mW; Temperature Coefficient: ±25ppm/℃; Operating Temperature Range: -55℃~+155℃; Function: R_V5_TOP; H7MS_Function: R_V5_TOP
R518 = RT0402BRD0710KL: 电阻类型:薄膜电阻;阻值:10kΩ;精度:±0.1%;功率:62.5mW;工作电压:50V;温度系数:±25ppm/℃;; LCSC Part Name: 薄膜电阻 10kΩ ±0.1% 62.5mW; Supplier Part: C190095; Manufacturer: YAGEO(国巨); Supplier Footprint: 0402; JLCPCB Part Class: Extended Part; Datasheet: https://item.szlcsc.com/datasheet/RT0402BRD0710KL/208478.html; Supplier: LCSC; Type: 薄膜电阻; Tolerance: ±0.1%; Power(Watts): 62.5mW; Voltage-Supply(Max): 50V; Temperature Coefficient: ±25ppm/℃; Operating Temperature: -55℃~+155℃; Function: R_V5_BOT; H7MS_Function: R_V5_BOT
R519 = RC0402FR-071KL: 电阻类型:厚膜电阻;阻值:1kΩ;精度:±1%;功率:62.5mW;工作电压:50V;温度系数:±100ppm/℃;; LCSC Part Name: 厚膜电阻 1kΩ ±1% 62.5mW; Supplier Part: C106235; Manufacturer: YAGEO(国巨); Supplier Footprint: 0402; JLCPCB Part Class: Extended Part; Datasheet: https://item.szlcsc.com/datasheet/RC0402FR-071KL/107450.html; Supplier: LCSC; Type: 厚膜电阻; Tolerance: ±1%; Power(Watts): 62.5mW; Voltage-Supply(Max): 50V; Temperature Coefficient: ±100ppm/℃; Operating Temperature: -55℃~+155℃; Function: R_V5_ADC; H7MS_Function: R_V5_ADC
U501 = BMI088: 传感器类型:IMU(加速度计+陀螺仪);接口类型:I2C；SPI;; Supplier Part: C194919; Manufacturer: Bosch(博世); Supplier Footprint: LGA-16(3x4.5); JLCPCB Part Class: Extended Part; Datasheet: https://item.szlcsc.com/datasheet/BMI088/239391.html; Supplier: LCSC; Accelerometer Sensing Axis: X,Y,Z; Acceleration Measurement Range (MAX): ±24g; Gyroscope Sensing Axis: X,Y,Z; Gyroscope Measurement Range (MAX): ±2000dps; Sensor Type: IMU(加速度计+陀螺仪); Output Bits: 16bit; Interface: I2C；SPI; Voltage - Supply: 2.4V~3.6V; Operating Temperature: -40℃~+85℃; Features: 运动事件检测；同步与时间戳; Function: U_IMU; H7MS_Function: U_IMU
U502 = TMP302ADRLR: 动作温度:65℃;; LCSC Part Name: 易于使用、低功耗、低电源温度、微封装温度开关; Supplier Part: C2877557; Manufacturer: TI(德州仪器); Supplier Footprint: SOT-563; JLCPCB Part Class: Extended Part; Datasheet: https://www.ti.com/cn/lit/ds/symlink/tmp302.pdf; Supplier: LCSC; Type: 半导体式; Number of Channels: 1; Operating Temperature: 65℃; Programmable Action Temperature Range: +50℃~+65℃; Temperature Hysteresis Configuration: 10℃；5℃; Accuracy of Operating Temperature: ±0.2℃; Voltage - Supply: 1.4V~3.6V; Current - Supply: 15uA; Quiescent Current: 15uA; Low Temperature (Cold) Detection: 不支持; Features: 可调滞回温度；可调温度阈值; Function: U_TEMP; H7MS_Function: U_TEMP
U503 = SN74LVC1G08DBVR: 逻辑类型:与门;门电路数量:1;工作电压:1.65V~5.5V;静态电流(Iq):10uA;传播延迟(tpd):4ns@5V,50pF;; LCSC Part Name: 单路 2 输入正与门; Supplier Part: C7666; Manufacturer: TI(德州仪器); Supplier Footprint: SOT-23-5; JLCPCB Part Class: Extended Part; Datasheet: https://www.ti.com/cn/lit/ds/symlink/sn74lvc1g08.pdf; Supplier: LCSC; Logic Type: 与门; Number of Gates: 1; Voltage - Supply: 1.65V~5.5V; Quiescent Current: 10uA; Current - Output Low(IOL): 32mA; Current - Output High(IOH): 32mA; Input Logic Level - High: 2V；1.7V; Input Logic Level - Low: 800mV；700mV; Output Logic Level - High: 1.9V；2.3V；1.2V；3.8V; Output Logic Level - Low: 550mV；300mV；450mV; Series: 74LVC系列; Propagation Delay: 4ns@5V,50pF; Operating Temperature: -40℃~+125℃; Inputs per Gates: 2; Features: 局部关断模式；过压容忍输入；带电插入保护；后驱动保护; Function: U_HEAT_GATE; H7MS_Function: U_HEAT_GATE
U504 = TPS22919DCKR: 类型:负载开关;通道数:1;输入控制逻辑:高电平有效;工作电压:1.6V~5.5V;最大连续电流:1.5A;导通电阻:89mΩ;; LCSC Part Name: 具有受控上升时间的5.5V、1.5A、90mΩ自保护负载开关; Supplier Part: C2149796; Manufacturer: TI(德州仪器); Supplier Footprint: SC-70-6; JLCPCB Part Class: Extended Part; Datasheet: https://www.ti.com/cn/lit/ds/symlink/tps22919.pdf; Supplier: LCSC; Type: 负载开关; Number of Channels: 1; Control Input Logic: 高电平有效; Voltage - Supply: 1.6V~5.5V; Maximum Continuous Current: 1.5A; RDS(on): 89mΩ; Features: 短路保护；过流保护；输出放电功能；软启动；过温保护; Operating Temperature	-: -40℃~+125℃; Function: U_HEAT_POWER; H7MS_Function: U_HEAT_POWER
C601 = GRM21BR61E106KA73L: 容值:10uF;精度:±10%;额定电压:25V;温度系数:X5R;; LCSC Part Name: 10uF ±10% 25V; Supplier Part: C84416; Manufacturer: muRata(村田); Supplier Footprint: 0805; JLCPCB Part Class: Extended Part; Datasheet: https://item.szlcsc.com/datasheet/GRM21BR61E106KA73L/85586.html; Supplier: LCSC; Tolerance: ±10%; Voltage Rating: 25V; Temperature Coefficient: X5R; Function: C_CAN_BULK; H7MS_Function: C_CAN_BULK
C602 = C1005X7R1H104K050BB: 容值:100nF;精度:±10%;额定电压:50V;温度系数:X7R;; LCSC Part Name: 100nF ±10% 50V; Supplier Part: C2181015; Manufacturer: TDK; Supplier Footprint: 0402; JLCPCB Part Class: Extended Part; Datasheet: https://item.szlcsc.com/datasheet/C1005X7R1H104K050BB/2273082.html; Supplier: LCSC; Tolerance: ±10%; Voltage Rating: 50V; Temperature Coefficient: X7R; Function: C_CAN1_VCC; H7MS_Function: C_CAN1_VCC
C603 = C1005X7R1H104K050BB: 容值:100nF;精度:±10%;额定电压:50V;温度系数:X7R;; LCSC Part Name: 100nF ±10% 50V; Supplier Part: C2181015; Manufacturer: TDK; Supplier Footprint: 0402; JLCPCB Part Class: Extended Part; Datasheet: https://item.szlcsc.com/datasheet/C1005X7R1H104K050BB/2273082.html; Supplier: LCSC; Tolerance: ±10%; Voltage Rating: 50V; Temperature Coefficient: X7R; Function: C_CAN1_VIO; H7MS_Function: C_CAN1_VIO
C604 = C1005X7R1H104K050BB: 容值:100nF;精度:±10%;额定电压:50V;温度系数:X7R;; LCSC Part Name: 100nF ±10% 50V; Supplier Part: C2181015; Manufacturer: TDK; Supplier Footprint: 0402; JLCPCB Part Class: Extended Part; Datasheet: https://item.szlcsc.com/datasheet/C1005X7R1H104K050BB/2273082.html; Supplier: LCSC; Tolerance: ±10%; Voltage Rating: 50V; Temperature Coefficient: X7R; Function: C_CAN2_VCC; H7MS_Function: C_CAN2_VCC
C605 = C1005X7R1H104K050BB: 容值:100nF;精度:±10%;额定电压:50V;温度系数:X7R;; LCSC Part Name: 100nF ±10% 50V; Supplier Part: C2181015; Manufacturer: TDK; Supplier Footprint: 0402; JLCPCB Part Class: Extended Part; Datasheet: https://item.szlcsc.com/datasheet/C1005X7R1H104K050BB/2273082.html; Supplier: LCSC; Tolerance: ±10%; Voltage Rating: 50V; Temperature Coefficient: X7R; Function: C_CAN2_VIO; H7MS_Function: C_CAN2_VIO
C606 = C1005X7R1H104K050BB: 容值:100nF;精度:±10%;额定电压:50V;温度系数:X7R;; LCSC Part Name: 100nF ±10% 50V; Supplier Part: C2181015; Manufacturer: TDK; Supplier Footprint: 0402; JLCPCB Part Class: Extended Part; Datasheet: https://item.szlcsc.com/datasheet/C1005X7R1H104K050BB/2273082.html; Supplier: LCSC; Tolerance: ±10%; Voltage Rating: 50V; Temperature Coefficient: X7R; Function: C_CAN3_VCC; H7MS_Function: C_CAN3_VCC
C607 = C1005X7R1H104K050BB: 容值:100nF;精度:±10%;额定电压:50V;温度系数:X7R;; LCSC Part Name: 100nF ±10% 50V; Supplier Part: C2181015; Manufacturer: TDK; Supplier Footprint: 0402; JLCPCB Part Class: Extended Part; Datasheet: https://item.szlcsc.com/datasheet/C1005X7R1H104K050BB/2273082.html; Supplier: LCSC; Tolerance: ±10%; Voltage Rating: 50V; Temperature Coefficient: X7R; Function: C_CAN3_VIO; H7MS_Function: C_CAN3_VIO
D601 = PESD2CANFD24V-TR: 极性:双向;反向截止电压(Vrwm):24V;钳位电压:42V;峰值脉冲电流(Ipp):2.6A@8/20us;峰值脉冲功率(Ppp):-;击穿电压(VBR):25.5V;; LCSC Part Name: 双向ESD 24V截止 峰值浪涌电流：2.6A@8/20us; Supplier Part: C552486; Manufacturer: Nexperia(安世); Supplier Footprint: SOT-23; JLCPCB Part Class: Extended Part; Datasheet: https://item.szlcsc.com/datasheet/PESD2CANFD24V-TR/573483.html; Supplier: LCSC; Polarity: 双向; Reverse Stand-Off Voltage (Vrwm): 24V; Clamping Voltage: 42V; Peak Pulse Current (Ipp): 2.6A@8/20us; Voltage - Breakdown: 25.5V; Reverse Leakage Current (Ir): 50nA; Operating Temperature: -55℃~+175℃; level of protection: IEC 61000-4-2; Type: ESD; Junction Capacitance: 6pF; Function: D_CAN1; H7MS_Function: D_CAN1
D602 = PESD2CANFD24V-TR: 极性:双向;反向截止电压(Vrwm):24V;钳位电压:42V;峰值脉冲电流(Ipp):2.6A@8/20us;峰值脉冲功率(Ppp):-;击穿电压(VBR):25.5V;; LCSC Part Name: 双向ESD 24V截止 峰值浪涌电流：2.6A@8/20us; Supplier Part: C552486; Manufacturer: Nexperia(安世); Supplier Footprint: SOT-23; JLCPCB Part Class: Extended Part; Datasheet: https://item.szlcsc.com/datasheet/PESD2CANFD24V-TR/573483.html; Supplier: LCSC; Polarity: 双向; Reverse Stand-Off Voltage (Vrwm): 24V; Clamping Voltage: 42V; Peak Pulse Current (Ipp): 2.6A@8/20us; Voltage - Breakdown: 25.5V; Reverse Leakage Current (Ir): 50nA; Operating Temperature: -55℃~+175℃; level of protection: IEC 61000-4-2; Type: ESD; Junction Capacitance: 6pF; Function: D_CAN2; H7MS_Function: D_CAN2
D603 = PESD2CANFD24V-TR: 极性:双向;反向截止电压(Vrwm):24V;钳位电压:42V;峰值脉冲电流(Ipp):2.6A@8/20us;峰值脉冲功率(Ppp):-;击穿电压(VBR):25.5V;; LCSC Part Name: 双向ESD 24V截止 峰值浪涌电流：2.6A@8/20us; Supplier Part: C552486; Manufacturer: Nexperia(安世); Supplier Footprint: SOT-23; JLCPCB Part Class: Extended Part; Datasheet: https://item.szlcsc.com/datasheet/PESD2CANFD24V-TR/573483.html; Supplier: LCSC; Polarity: 双向; Reverse Stand-Off Voltage (Vrwm): 24V; Clamping Voltage: 42V; Peak Pulse Current (Ipp): 2.6A@8/20us; Voltage - Breakdown: 25.5V; Reverse Leakage Current (Ir): 50nA; Operating Temperature: -55℃~+175℃; level of protection: IEC 61000-4-2; Type: ESD; Junction Capacitance: 6pF; Function: D_CAN3; H7MS_Function: D_CAN3
R601 = RC0402FR-0710KL: 电阻类型:厚膜电阻;阻值:10kΩ;精度:±1%;功率:62.5mW;工作电压:50V;温度系数:±100ppm/℃;; LCSC Part Name: 厚膜电阻 10kΩ ±1% 62.5mW; Supplier Part: C60490; Manufacturer: YAGEO(国巨); Supplier Footprint: 0402; JLCPCB Part Class: Extended Part; Datasheet: https://item.szlcsc.com/datasheet/RC0402FR-0710KL/61542.html; Supplier: LCSC; Type: 厚膜电阻; Tolerance: ±1%; Power(Watts): 62.5mW; Voltage-Supply(Max): 50V; Temperature Coefficient: ±100ppm/℃; Operating Temperature: -55℃~+155℃; Function: R_CAN1_STB; H7MS_Function: R_CAN1_STB
R602 = RC0402FR-0710KL: 电阻类型:厚膜电阻;阻值:10kΩ;精度:±1%;功率:62.5mW;工作电压:50V;温度系数:±100ppm/℃;; LCSC Part Name: 厚膜电阻 10kΩ ±1% 62.5mW; Supplier Part: C60490; Manufacturer: YAGEO(国巨); Supplier Footprint: 0402; JLCPCB Part Class: Extended Part; Datasheet: https://item.szlcsc.com/datasheet/RC0402FR-0710KL/61542.html; Supplier: LCSC; Type: 厚膜电阻; Tolerance: ±1%; Power(Watts): 62.5mW; Voltage-Supply(Max): 50V; Temperature Coefficient: ±100ppm/℃; Operating Temperature: -55℃~+155℃; Function: R_CAN1_TX; H7MS_Function: R_CAN1_TX
R603 = RC0402FR-0710KL: 电阻类型:厚膜电阻;阻值:10kΩ;精度:±1%;功率:62.5mW;工作电压:50V;温度系数:±100ppm/℃;; LCSC Part Name: 厚膜电阻 10kΩ ±1% 62.5mW; Supplier Part: C60490; Manufacturer: YAGEO(国巨); Supplier Footprint: 0402; JLCPCB Part Class: Extended Part; Datasheet: https://item.szlcsc.com/datasheet/RC0402FR-0710KL/61542.html; Supplier: LCSC; Type: 厚膜电阻; Tolerance: ±1%; Power(Watts): 62.5mW; Voltage-Supply(Max): 50V; Temperature Coefficient: ±100ppm/℃; Operating Temperature: -55℃~+155℃; Function: R_CAN2_STB; H7MS_Function: R_CAN2_STB
R604 = RC0402FR-0710KL: 电阻类型:厚膜电阻;阻值:10kΩ;精度:±1%;功率:62.5mW;工作电压:50V;温度系数:±100ppm/℃;; LCSC Part Name: 厚膜电阻 10kΩ ±1% 62.5mW; Supplier Part: C60490; Manufacturer: YAGEO(国巨); Supplier Footprint: 0402; JLCPCB Part Class: Extended Part; Datasheet: https://item.szlcsc.com/datasheet/RC0402FR-0710KL/61542.html; Supplier: LCSC; Type: 厚膜电阻; Tolerance: ±1%; Power(Watts): 62.5mW; Voltage-Supply(Max): 50V; Temperature Coefficient: ±100ppm/℃; Operating Temperature: -55℃~+155℃; Function: R_CAN2_TX; H7MS_Function: R_CAN2_TX
R605 = RC0402FR-0710KL: 电阻类型:厚膜电阻;阻值:10kΩ;精度:±1%;功率:62.5mW;工作电压:50V;温度系数:±100ppm/℃;; LCSC Part Name: 厚膜电阻 10kΩ ±1% 62.5mW; Supplier Part: C60490; Manufacturer: YAGEO(国巨); Supplier Footprint: 0402; JLCPCB Part Class: Extended Part; Datasheet: https://item.szlcsc.com/datasheet/RC0402FR-0710KL/61542.html; Supplier: LCSC; Type: 厚膜电阻; Tolerance: ±1%; Power(Watts): 62.5mW; Voltage-Supply(Max): 50V; Temperature Coefficient: ±100ppm/℃; Operating Temperature: -55℃~+155℃; Function: R_CAN3_STB; H7MS_Function: R_CAN3_STB
R606 = RC0402FR-0710KL: 电阻类型:厚膜电阻;阻值:10kΩ;精度:±1%;功率:62.5mW;工作电压:50V;温度系数:±100ppm/℃;; LCSC Part Name: 厚膜电阻 10kΩ ±1% 62.5mW; Supplier Part: C60490; Manufacturer: YAGEO(国巨); Supplier Footprint: 0402; JLCPCB Part Class: Extended Part; Datasheet: https://item.szlcsc.com/datasheet/RC0402FR-0710KL/61542.html; Supplier: LCSC; Type: 厚膜电阻; Tolerance: ±1%; Power(Watts): 62.5mW; Voltage-Supply(Max): 50V; Temperature Coefficient: ±100ppm/℃; Operating Temperature: -55℃~+155℃; Function: R_CAN3_TX; H7MS_Function: R_CAN3_TX
U601 = H7MS_TCAN1042HGVDRBRQ1: Pin 5 corrected to VIO per TI datasheet; Manufacturer: TI(德州仪器); Supplier: LCSC; Supplier Part: C2671243; Function: U_CAN1; H7MS_Function: U_CAN1
U602 = H7MS_TCAN1042HGVDRBRQ1: Pin 5 corrected to VIO per TI datasheet; Manufacturer: TI(德州仪器); Supplier: LCSC; Supplier Part: C2671243; Function: U_CAN2; H7MS_Function: U_CAN2
U603 = H7MS_TCAN1042HGVDRBRQ1: Pin 5 corrected to VIO per TI datasheet; Manufacturer: TI(德州仪器); Supplier: LCSC; Supplier Part: C2671243; Function: U_CAN3; H7MS_Function: U_CAN3
C701 = C1005X7R1H104K050BB: 容值:100nF;精度:±10%;额定电压:50V;温度系数:X7R;; LCSC Part Name: 100nF ±10% 50V; Supplier Part: C2181015; Manufacturer: TDK; Supplier Footprint: 0402; JLCPCB Part Class: Extended Part; Datasheet: https://item.szlcsc.com/datasheet/C1005X7R1H104K050BB/2273082.html; Supplier: LCSC; Tolerance: ±10%; Voltage Rating: 50V; Temperature Coefficient: X7R; Function: C_USB_VBUS; H7MS_Function: C_USB_VBUS
C702 = C1005X7R1H104K050BB: 容值:100nF;精度:±10%;额定电压:50V;温度系数:X7R;; LCSC Part Name: 100nF ±10% 50V; Supplier Part: C2181015; Manufacturer: TDK; Supplier Footprint: 0402; JLCPCB Part Class: Extended Part; Datasheet: https://item.szlcsc.com/datasheet/C1005X7R1H104K050BB/2273082.html; Supplier: LCSC; Tolerance: ±10%; Voltage Rating: 50V; Temperature Coefficient: X7R; Function: C_VBUS_U; H7MS_Function: C_VBUS_U
J701 = H7MS_USB4105_GF_A_120_B4_R3: GCT B4 pad positions; B5=+1.25mm, A8=+1.75mm. No shell paste. 3D body intentionally unassociated pending exact model.; Manufacturer: GCT; Supplier: LCSC; Supplier Part: C5184243; LCSC Part Name: Type-C 母; Supplier Footprint: SMD; JLCPCB Part Class: Extended Part; Datasheet: https://item.szlcsc.com/datasheet/USB4105-GF-A-120/5849584.html; Connector Type: Type-C; Protocol Standard: USB 2.0; Gender: 母; Number of Contacts: 16P; Number of Ports: 1; Current Rating-Power: 5A; Voltage Rating: 48V; Detection color: 黑色; Operating Temperature: -40℃~+85℃
R701 = RC0402FR-075K1L: 电阻类型:厚膜电阻;阻值:5.1kΩ;精度:±1%;功率:62.5mW;工作电压:50V;温度系数:±100ppm/℃;; LCSC Part Name: 厚膜电阻 5.1kΩ ±1% 62.5mW; Supplier Part: C105872; Manufacturer: YAGEO(国巨); Supplier Footprint: 0402; JLCPCB Part Class: Extended Part; Datasheet: https://item.szlcsc.com/datasheet/RC0402FR-075K1L/107087.html; Supplier: LCSC; Type: 厚膜电阻; Tolerance: ±1%; Power(Watts): 62.5mW; Voltage-Supply(Max): 50V; Temperature Coefficient: ±100ppm/℃; Operating Temperature: -55℃~+155℃; Function: R_CC1; H7MS_Function: R_CC1
R702 = RC0402FR-075K1L: 电阻类型:厚膜电阻;阻值:5.1kΩ;精度:±1%;功率:62.5mW;工作电压:50V;温度系数:±100ppm/℃;; LCSC Part Name: 厚膜电阻 5.1kΩ ±1% 62.5mW; Supplier Part: C105872; Manufacturer: YAGEO(国巨); Supplier Footprint: 0402; JLCPCB Part Class: Extended Part; Datasheet: https://item.szlcsc.com/datasheet/RC0402FR-075K1L/107087.html; Supplier: LCSC; Type: 厚膜电阻; Tolerance: ±1%; Power(Watts): 62.5mW; Voltage-Supply(Max): 50V; Temperature Coefficient: ±100ppm/℃; Operating Temperature: -55℃~+155℃; Function: R_CC2; H7MS_Function: R_CC2
R703 = RC0402JR-070RL: 电阻类型:厚膜电阻;阻值:0Ω;精度:±5%;功率:62.5mW;工作电压:50V;温度系数:-;; LCSC Part Name: 厚膜电阻 0Ω ±5% 62.5mW; Supplier Part: C60485; Manufacturer: YAGEO(国巨); Supplier Footprint: 0402; JLCPCB Part Class: Extended Part; Datasheet: https://item.szlcsc.com/datasheet/RC0402JR-070RL/61537.html; Supplier: LCSC; Type: 厚膜电阻; Tolerance: ±5%; Power(Watts): 62.5mW; Voltage-Supply(Max): 50V; Operating Temperature: -55℃~+155℃; Function: R_USB_SHELL; H7MS_Function: R_USB_SHELL
R704 = RC0402JR-070RL: 电阻类型:厚膜电阻;阻值:0Ω;精度:±5%;功率:62.5mW;工作电压:50V;温度系数:-;; LCSC Part Name: 厚膜电阻 0Ω ±5% 62.5mW; Supplier Part: C60485; Manufacturer: YAGEO(国巨); Supplier Footprint: 0402; JLCPCB Part Class: Extended Part; Datasheet: https://item.szlcsc.com/datasheet/RC0402JR-070RL/61537.html; Supplier: LCSC; Type: 厚膜电阻; Tolerance: ±5%; Power(Watts): 62.5mW; Voltage-Supply(Max): 50V; Operating Temperature: -55℃~+155℃; Function: R_USB_DP; H7MS_Function: R_USB_DP
R705 = RC0402JR-070RL: 电阻类型:厚膜电阻;阻值:0Ω;精度:±5%;功率:62.5mW;工作电压:50V;温度系数:-;; LCSC Part Name: 厚膜电阻 0Ω ±5% 62.5mW; Supplier Part: C60485; Manufacturer: YAGEO(国巨); Supplier Footprint: 0402; JLCPCB Part Class: Extended Part; Datasheet: https://item.szlcsc.com/datasheet/RC0402JR-070RL/61537.html; Supplier: LCSC; Type: 厚膜电阻; Tolerance: ±5%; Power(Watts): 62.5mW; Voltage-Supply(Max): 50V; Operating Temperature: -55℃~+155℃; Function: R_USB_DM; H7MS_Function: R_USB_DM
R706 = RC0402FR-071KL: 电阻类型:厚膜电阻;阻值:1kΩ;精度:±1%;功率:62.5mW;工作电压:50V;温度系数:±100ppm/℃;; LCSC Part Name: 厚膜电阻 1kΩ ±1% 62.5mW; Supplier Part: C106235; Manufacturer: YAGEO(国巨); Supplier Footprint: 0402; JLCPCB Part Class: Extended Part; Datasheet: https://item.szlcsc.com/datasheet/RC0402FR-071KL/107450.html; Supplier: LCSC; Type: 厚膜电阻; Tolerance: ±1%; Power(Watts): 62.5mW; Voltage-Supply(Max): 50V; Temperature Coefficient: ±100ppm/℃; Operating Temperature: -55℃~+155℃; Function: R_VBUS_SER; H7MS_Function: R_VBUS_SER
R707 = RC0402FR-07100KL: 电阻类型:厚膜电阻;阻值:100kΩ;精度:±1%;功率:62.5mW;工作电压:50V;温度系数:±100ppm/℃;; LCSC Part Name: 厚膜电阻 100kΩ ±1% 62.5mW; Supplier Part: C60491; Manufacturer: YAGEO(国巨); Supplier Footprint: 0402; JLCPCB Part Class: Extended Part; Datasheet: https://item.szlcsc.com/datasheet/RC0402FR-07100KL/61543.html; Supplier: LCSC; Type: 厚膜电阻; Tolerance: ±1%; Power(Watts): 62.5mW; Voltage-Supply(Max): 50V; Temperature Coefficient: ±100ppm/℃; Operating Temperature: -55℃~+155℃; Function: R_VBUS_PD; H7MS_Function: R_VBUS_PD
U701 = USBLC6-2SC6_C7519: 极性:单向;反向截止电压(Vrwm):5.25V;钳位电压:17V;峰值脉冲电流(Ipp):5A;击穿电压(VBR):6V;; LCSC Part Name: 单向ESD 5.25V截止 峰值脉冲电流：5A; Supplier Part: C7519; Manufacturer: ST(意法半导体); Supplier Footprint: SOT-23-6L; JLCPCB Part Class: Extended Part; Datasheet: https://item.szlcsc.com/datasheet/USBLC6-2SC6/7996.html; Supplier: LCSC; Polarity: 单向; Reverse Stand-Off Voltage (Vrwm): 5.25V; Clamping Voltage: 17V; Peak Pulse Current (Ipp): 5A; Voltage - Breakdown: 6V; Reverse Leakage Current (Ir): 150nA; Number of Channels: 双路; Operating Temperature: -40℃~+125℃; level of protection: IEC 61000-4-2; Type: ESD; Junction Capacitance: 3.5pF; Function: U_USB_ESD; H7MS_Function: U_USB_ESD
U702 = SN74LVC1G17DBVR: 输入类型:施密特触发器;工作电压:1.65V~5.5V;元件数:1;每个元件位数:1;灌电流(IOL):32mA;拉电流(IOH):32mA;; LCSC Part Name: 单施密特触发器缓冲器; Supplier Part: C7836; Manufacturer: TI(德州仪器); Supplier Footprint: SOT-23-5; JLCPCB Part Class: Extended Part; Datasheet: https://www.ti.com/cn/lit/ds/symlink/sn74lvc1g17.pdf; Supplier: LCSC; Input type: 施密特触发器; output type: 推挽式; Voltage - Supply: 1.65V~5.5V; Number of Elements: 1; Number of Bits per Element: 1; Channel Type: 单向; Current - Output Low(IOL): 32mA; Current - Output High(IOH): 32mA; Logic Family: 74LVC; Operating Temperature: -40℃~+125℃; Quiescent Current: 10uA; Propagation Delay: 4.6ns@3.3V,15pF; Features: 掉电隔离；电平转换; Function: U_VBUS; H7MS_Function: U_VBUS
J801 = TFM-125-02-L-D-A: 插针结构:2x25P;间距:1.27mm;安装方式:立贴;总PIN数:50P;排数:2;每排PIN数:25;行距:1.27mm;额定电流:3.2A;触头材质:磷青铜;触头镀层:锡;工作温度:-55℃~+125℃;; LCSC Part Name: 2x25P 间距:1.27mm 立贴; Supplier Part: C17489091; Manufacturer: SAMTEC; Supplier Footprint: SMD,P=1.27mm; JLCPCB Part Class: Extended Part; Datasheet: https://item.szlcsc.com/datasheet/TFM-125-02-L-D-A/18618286.html; Supplier: LCSC; Pins Structure: 2x25P; Pitch: 1.27mm; Mounting Type: 立贴; Number of Pins: 50P; Number of Rows: 2; Number of PINs Per Row: 25; Row Spacing: 1.27mm; Current Rating: 3.2A; Contact Material: 磷青铜; Contact Plating: 锡; Operating Temperature: -55℃~+125℃; Voltage Rating: 250V; Plastic Material: LCP; Flame Retardant Rating: UL94V-0; Color: 黑色; Z-Height of the Board: 5.72mm; X-Length of Bottom Edge on Board (Spacing Line): 34.93mm; Y-Width of Bottom Edge on Board: 5.72mm; Function: J1; H7MS_Function: J1
J802 = TFM-125-02-L-D-A: 插针结构:2x25P;间距:1.27mm;安装方式:立贴;总PIN数:50P;排数:2;每排PIN数:25;行距:1.27mm;额定电流:3.2A;触头材质:磷青铜;触头镀层:锡;工作温度:-55℃~+125℃;; LCSC Part Name: 2x25P 间距:1.27mm 立贴; Supplier Part: C17489091; Manufacturer: SAMTEC; Supplier Footprint: SMD,P=1.27mm; JLCPCB Part Class: Extended Part; Datasheet: https://item.szlcsc.com/datasheet/TFM-125-02-L-D-A/18618286.html; Supplier: LCSC; Pins Structure: 2x25P; Pitch: 1.27mm; Mounting Type: 立贴; Number of Pins: 50P; Number of Rows: 2; Number of PINs Per Row: 25; Row Spacing: 1.27mm; Current Rating: 3.2A; Contact Material: 磷青铜; Contact Plating: 锡; Operating Temperature: -55℃~+125℃; Voltage Rating: 250V; Plastic Material: LCP; Flame Retardant Rating: UL94V-0; Color: 黑色; Z-Height of the Board: 5.72mm; X-Length of Bottom Edge on Board (Spacing Line): 34.93mm; Y-Width of Bottom Edge on Board: 5.72mm; Function: J2; H7MS_Function: J2
TP801 = H7MS_PCB_TP_0.8: PCB copper feature, no purchased part; Function: TP_5V_IN; H7MS_Function: TP_5V_IN
TP802 = H7MS_PCB_TP_0.8: PCB copper feature, no purchased part; Function: TP_3V3_D; H7MS_Function: TP_3V3_D
TP803 = H7MS_PCB_TP_0.8: PCB copper feature, no purchased part; Function: TP_3V3_A; H7MS_Function: TP_3V3_A
TP804 = H7MS_PCB_TP_0.8: PCB copper feature, no purchased part; Function: TP_3V3_AUX; H7MS_Function: TP_3V3_AUX
TP805 = H7MS_PCB_TP_0.8: PCB copper feature, no purchased part; Function: TP_VCORE; H7MS_Function: TP_VCORE
TP806 = H7MS_PCB_TP_0.8: PCB copper feature, no purchased part; Function: TP_GND; H7MS_Function: TP_GND
TP807 = H7MS_PCB_TP_0.8: PCB copper feature, no purchased part; Function: TP_NRST; H7MS_Function: TP_NRST
TP808 = H7MS_PCB_TP_0.8: PCB copper feature, no purchased part; Function: TP_BOOT0; H7MS_Function: TP_BOOT0
TP809 = H7MS_PCB_TP_0.8: PCB copper feature, no purchased part; Function: TP_TEMP_OK; H7MS_Function: TP_TEMP_OK
TP810 = H7MS_PCB_TP_0.8: PCB copper feature, no purchased part; Function: TP_HEAT_ALLOW; H7MS_Function: TP_HEAT_ALLOW
TP811 = H7MS_PCB_TP_0.8: PCB copper feature, no purchased part; Function: TP_HEAT_5V; H7MS_Function: TP_HEAT_5V
TP812 = H7MS_PCB_TP_0.8: PCB copper feature, no purchased part; Function: TP_AUX_FAULT_N; H7MS_Function: TP_AUX_FAULT_N
TP813 = H7MS_PCB_TP_0.8: PCB copper feature, no purchased part; Function: TP_BUCK_PG; H7MS_Function: TP_BUCK_PG

## Nets
3V3_A: R515.1 TP803.1(TP) ; also on sheet 1 2
3V3_AUX: J801.22 J801.24 TP804.1(TP) ; also on sheet 3
3V3_D: C504.1 C505.1 C603.1 C605.1 C607.1 C702.1 R501.1 R506.2 R601.2 R602.2 R603.2 R604.2 R605.2 R606.2 TP802.1(TP) U502.4(HYSTSET) U502.5(VS) U502.6(TRIPSET1) U503.5(VCC) U601.5(VIO) U602.5(VIO) U603.5(VIO) U702.5(VCC) ; also on sheet 1 2 3 4
3V3_IMU: C501.1 C502.1 C503.1 R501.2 R504.2 R505.2 U501.3(VDD) U501.11(VDDIO)
5V_IN: C506.1 C601.1 C602.1 C604.1 C606.1 J801.10 J801.12 J801.14 J801.16 J801.18 J801.20 R517.1 TP801.1(TP) U504.1(IN) U601.3(VCC) U602.3(VCC) U603.3(VCC) ; also on sheet 3
GND: C501.2 C502.2 C503.2 C504.2 C505.2 C506.2 C507.2 C508.2 C509.2 C601.2 C602.2 C603.2 C604.2 C605.2 C606.2 C607.2 C701.2 C702.2 D601.3 D602.3 D603.3 J701.A1-B12(GND) J701.B1-A12(GND) J801.3 J801.6 J801.9 J801.11 J801.13 J801.15 J801.17 J801.19 J801.21 J801.23 J801.25 J801.28 J801.31 J801.34 J801.37 J801.40 J801.43 J801.46 J801.49 J802.2 J802.5 J802.8 J802.11 J802.14 J802.17 J802.20 J802.23 J802.26 J802.29 J802.32 J802.35 J802.38 J802.41 J802.44 J802.47 J802.49 J802.50 NTC501.2 Q501.2(S) R507.2 R514.2 R518.2 R701.2 R702.2 R703.2 R707.2 TP806.1(TP) U501.2(NC) U501.4(GNDA) U501.6(GNDIO) U501.7(PS) U502.1(TRIPSET0) U502.2(GND) U503.3(GND) U504.2(GND) U601.2(GND) U601.9(EP) U602.2(GND) U602.9(EP) U603.2(GND) U603.9(EP) U701.2 U702.3(GND) ; also on sheet 1 2 3 4
V5_NODE: R517.2 R518.1 R519.1
VBUS_PRESENT: U702.4(Y) ; also on sheet 1
VBUS_SENSE: R706.2 R707.1 U702.2(A)
AUX_FAULT_N: TP812.1(TP) ; also on sheet 3
BOOT0: TP808.1(TP) ; also on sheet 1 4
BUCK_PG: TP813.1(TP) ; also on sheet 3
CAN1_H: D601.2 J801.1 U601.7(CANH)
CAN1_L: D601.1 J801.2 U601.6(CANL)
CAN1_RX: U601.4(RXD) ; also on sheet 1
CAN1_STB: R601.1 U601.8(STB) ; also on sheet 1
CAN1_TX: R602.1 U601.1(TXD) ; also on sheet 1
CAN2_H: D602.2 J801.4 U602.7(CANH)
CAN2_L: D602.1 J801.5 U602.6(CANL)
CAN2_RX: U602.4(RXD) ; also on sheet 1
CAN2_STB: R603.1 U602.8(STB) ; also on sheet 1
CAN2_TX: R604.1 U602.1(TXD) ; also on sheet 1
CAN3_H: D603.2 J801.7 U603.7(CANH)
CAN3_L: D603.1 J801.8 U603.6(CANL)
CAN3_RX: U603.4(RXD) ; also on sheet 1
CAN3_STB: R605.1 U603.8(STB) ; also on sheet 1
CAN3_TX: R606.1 U603.1(TXD) ; also on sheet 1
EXP_PA0: J801.26 ; also on sheet 1
EXP_PA1: J801.27 ; also on sheet 1
EXP_PA2: J801.32 ; also on sheet 1
EXP_PA3: J801.33 ; also on sheet 1
EXP_PA4: J801.35 ; also on sheet 1
EXP_PA5: J801.36 ; also on sheet 1
EXP_PA6: J801.38 ; also on sheet 1
EXP_PA7: J801.39 ; also on sheet 1
EXP_PA8: J801.41 ; also on sheet 1
EXP_PA10: J801.29 ; also on sheet 1
EXP_PA15: J801.30 ; also on sheet 1
EXP_PB0: J801.42 ; also on sheet 1
EXP_PB1: J801.44 ; also on sheet 1
EXP_PB2: J802.4 ; also on sheet 1
EXP_PB3: J802.6 ; also on sheet 1
EXP_PB4: J802.7 ; also on sheet 1
EXP_PB7: J802.9 ; also on sheet 1
EXP_PB10: J801.45 ; also on sheet 1
EXP_PB11: J801.47 ; also on sheet 1
EXP_PB12: J801.48 ; also on sheet 1
EXP_PB13: J801.50 ; also on sheet 1
EXP_PB14: J802.1 ; also on sheet 1
EXP_PB15: J802.3 ; also on sheet 1
EXP_PC0: J802.10 ; also on sheet 1
EXP_PC1: J802.12 ; also on sheet 1
EXP_PC4: J802.18 ; also on sheet 1
EXP_PC5: J802.19 ; also on sheet 1
EXP_PC6: J802.21 ; also on sheet 1
EXP_PC7: J802.22 ; also on sheet 1
EXP_PC8: J802.24 ; also on sheet 1
EXP_PC9: J802.25 ; also on sheet 1
EXP_PC10: J802.13 ; also on sheet 1
EXP_PC11: J802.15 ; also on sheet 1
EXP_PC12: J802.16 ; also on sheet 1
EXP_PD0: J802.27 ; also on sheet 1
EXP_PD1: J802.28 ; also on sheet 1
EXP_PD2: J802.34 ; also on sheet 1
EXP_PD5: J802.36 ; also on sheet 1
EXP_PD6: J802.37 ; also on sheet 1
EXP_PD8: J802.39 ; also on sheet 1
EXP_PD9: J802.40 ; also on sheet 1
EXP_PD11: J802.30 ; also on sheet 1
EXP_PD14: J802.31 ; also on sheet 1
EXP_PD15: J802.33 ; also on sheet 1
EXP_PE0: J802.42 ; also on sheet 1
EXP_PE1: J802.43 ; also on sheet 1
EXP_PE7: J802.46 ; also on sheet 1
EXP_PE8: J802.48 ; also on sheet 1
EXP_PE10: J802.45 ; also on sheet 1
HEAT_5V: C507.1 R508.2 R509.1 R510.1 R511.1 R512.1 TP811.1(TP) U504.6(VOUT)
HEAT_ALLOW: R507.1 TP810.1(TP) U503.4(Y) U504.3(ON)
HEAT_DRAIN: Q501.3(D) R509.2 R510.2 R511.2 R512.2
HEAT_GATE: Q501.1(G) R513.2 R514.1
IMU_ACC_CS: R504.1 U501.14(CSB1) ; also on sheet 1
IMU_ACC_IRQ: U501.16(INT1) ; also on sheet 1
IMU_GYRO_CS: R505.1 U501.5(CSB2) ; also on sheet 1
IMU_GYRO_IRQ: U501.12(INT3) ; also on sheet 1
IMU_HEATER_NTC: C508.1 R516.2 ; also on sheet 1
IMU_HEATER_PWM: R513.1 ; also on sheet 1
IMU_MISO: U501.10(SDO2) U501.15(SDO1) ; also on sheet 1
IMU_MOSI: R503.1 ; also on sheet 1
IMU_MOSI_DEV: R503.2 U501.9(SDA/SDI)
IMU_SCK: R502.1 ; also on sheet 1
IMU_SCK_DEV: R502.2 U501.8(SCL/SCK)
LOCAL_5V_ADC: C509.1 R519.2 ; also on sheet 1
NRST: TP807.1(TP) U503.2(B) ; also on sheet 1 4
NTC_NODE: NTC501.1 R515.2 R516.1
TEMP_OK: R506.1 TP809.1(TP) U502.3(OUT) U503.1(A)
U_HEAT_POWER_QOD: R508.1 U504.5(QOD)
USB_CC1: J701.A5(CC1) R701.1
USB_CC2: J701.B5(CC2) R702.1
USB_DM: R705.2 ; also on sheet 1
USB_DM_CONN: J701.A7(Dn1) J701.B7(Dn2) R705.1 U701.3 U701.4
USB_DP: R704.2 ; also on sheet 1
USB_DP_CONN: J701.A6(Dp1) J701.B6(Dp2) R704.1 U701.1 U701.6
USB_SHELL: J701.1(EH) J701.2(EH) J701.3(EH) J701.4(EH) R703.1
USB_VBUS: C701.1 J701.A4-B9(VBUS) J701.B4-A9(VBUS) R706.1 U701.5
VCORE: TP805.1(TP) ; also on sheet 1 2

Not connected (* = marked no-connect by the designer): J701 A8(SBU1)* B8(SBU2)*; U501 1(INT2)* 13(INT4)*; U504 4(NC)*; U702 1(N.C)*

## Notes on the sheets
sheet 5
- BMI088 / 加热安全链与模拟采样
- BMI088 / 加热安全链与模拟采样
- IMU 电源与双片选 SPI
- IMU 电源与双片选 SPI
- 硬件安全：温度开关 + NRST → HEAT_ALLOW
- 硬件安全：温度开关 + NRST → HEAT_ALLOW
- IMU 温度采样
- IMU 温度采样
- 5V 输入采样 / RC 滤波
- 5V 输入采样 / RC 滤波
- 加热：4 × 200Ω / 1206
- 加热：4 × 200Ω / 1206
sheet 6
- 三路 CAN / 逻辑供电 / 线端 ESD
- 三路 CAN / 逻辑供电 / 线端 ESD
- CAN1：TCAN1042HG / 5V VCC / 3.3V VIO
- CAN1：TCAN1042HG / 5V VCC / 3.3V VIO
- CAN2：TCAN1042HG / 5V VCC / 3.3V VIO
- CAN2：TCAN1042HG / 5V VCC / 3.3V VIO
- CANH / CANL 经板间连接器引出
  终端电阻位于扩展板
  STB 默认上拉：复位期间待机
- CANH / CANL 经板间连接器引出
  终端电阻位于扩展板
  STB 默认上拉：复位期间待机
- CAN3：TCAN1042HG / 5V VCC / 3.3V VIO
- CAN3：TCAN1042HG / 5V VCC / 3.3V VIO
sheet 7
- USB FS 设备接口 / ESD / VBUS 检测
- USB FS 设备接口 / ESD / VBUS 检测
- USB Type-C：自供电设备，仅使用 USB 2.0
- USB Type-C：自供电设备，仅使用 USB 2.0
- ESD → 串联预留 → MCU USB FS
- ESD → 串联预留 → MCU USB FS
- VBUS 检测：5V 容忍施密特输入，3.3V 输出
- VBUS 检测：5V 容忍施密特输入，3.3V 输出
- CC1 / CC2：各 5.1k 下拉
  外壳通过 0Ω 预留接系统地
  VBUS 不接入核心板 5V_IN
- CC1 / CC2：各 5.1k 下拉
  外壳通过 0Ω 预留接系统地
  VBUS 不接入核心板 5V_IN
sheet 8
- 板间连接器 / 电源与信号测试点
- 板间连接器 / 电源与信号测试点
- J801：电源 / 三路 CAN / 可复用 GPIO
- J801：电源 / 三路 CAN / 可复用 GPIO
- J802：可复用 GPIO / 地回流
- J802：可复用 GPIO / 地回流
- 测试点：0.8 mm 裸铜，开阻焊，不开锡膏
- 测试点：0.8 mm 裸铜，开阻焊，不开锡膏
